# EasyEDA Pro project JLC_Integrating_Sphere_Light_Source_2026-11-10.epro

# Schematic LED_CC_diver_G
Assembly Variant: Basic; Board Name: LED_CC_diver_G; Create Date: 2026-11-09; Page Name: P1; Project Name: LED_CC_diver_G; Schematic Name: LED_CC_diver_G; Update Date: 2026-11-09; Company: 嘉立创EDA; Page Size: A4; Version: V1.0
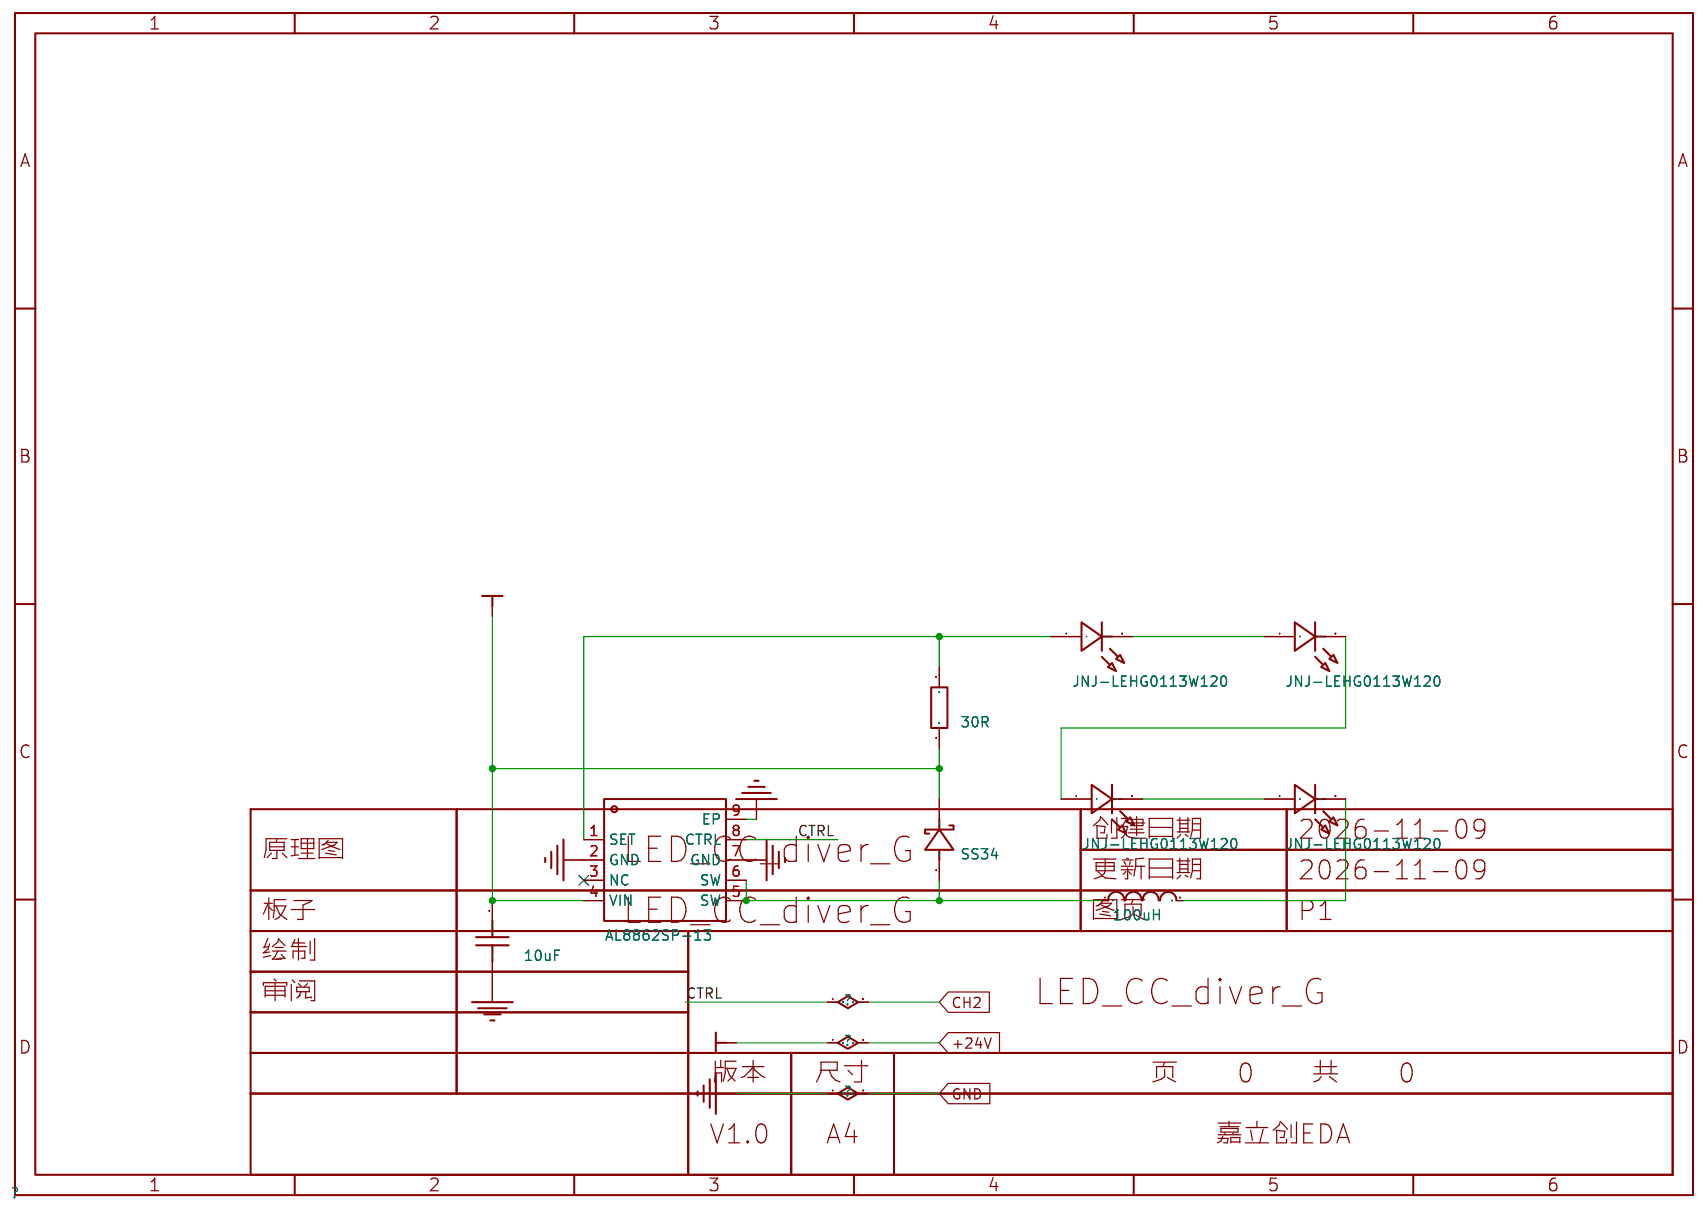
[diagram p0: schematic sheet]

## Parts
C2  10uF  [C1206]
D11  SS34  [SMA_L4.3-W2.6-LS5.0-FD]
L2  100uH  [L1210]
LED_G1  JNJ-LEHG0113W120  [LED-SMD_3P-L3.5-W3.5-R-RD_C9900043159]
LED_G2  JNJ-LEHG0113W120  [LED-SMD_3P-L3.5-W3.5-R-RD_C9900043159]
LED_G3  JNJ-LEHG0113W120  [LED-SMD_3P-L3.5-W3.5-R-RD_C9900043159]
LED_G4  JNJ-LEHG0113W120  [LED-SMD_3P-L3.5-W3.5-R-RD_C9900043159]
R2  30R  [R1206]
U5  AL8862SP-13  [SO-8_L4.9-W3.9-P1.27-LS6.0-BL-EP]

## Library data of the parts
C2 = CAP_1206: Supplier Footprint: 1206
D11 = SS34_C7420365: 二极管配置:独立式;正向压降(Vf):550mV@3A;直流反向耐压(Vr):40V;整流电流:3A;; LCSC Part Name: 电压:40V 电流:3A; Supplier Part: C7420365; Manufacturer: R+O(宏嘉诚); Supplier Footprint: SMA(DO-214AC); JLCPCB Part Class: Extended Part; Datasheet: https://item.szlcsc.com/datasheet/SS34/8397187.html; Supplier: LCSC; Diode Configuration: 独立式; Voltage - Forward(Vf@If): 550mV@3A; Voltage - DC Reverse(Vr): 40V; Current - Rectified: 3A; Reverse Leakage Current (Ir): 200uA@40V; Operating Junction Temperature Range: -55℃~+150℃; Non-Repetitive Peak Forward Surge Current: 80A
L2 = NLV32T-101J-PF: 电感值:100uH;精度:±5%;额定电流:40mA;饱和电流(Isat):-;类型:磁胶屏蔽电感;; LCSC Part Name: 100uH ±5% 停产; Supplier Part: C76836; Manufacturer: TDK; Supplier Footprint: 1210; JLCPCB Part Class: Extended Part; Datasheet: https://item.szlcsc.com/datasheet/NLV32T-101J-PF/77963.html; Supplier: LCSC; Tolerance: ±5%; Current Rating: 40mA; DC Resistance(DCR): 10Ω; Type: 磁胶屏蔽电感
LED_G1-LED_G4 = JNJ-LEHG0113W120/45mil/525-530nm: 灯头类型:3.5mmx3.5mm方形灯头;发光颜色:绿色;正向压降(Vf):2.8V~3.5V;功率:-;正向电流:700mA;波长:515nm~530nm;二极管配置:独立二极管;透镜颜色:无色透明透镜;色温:-;发光强度:50cd;发光角度:120°;载带方式:-;工作温度:-40℃~+100℃;; LCSC Part Name: 3535EMC绿光45mil球头120度灯源525-530nm; Supplier Part: C19185875; Manufacturer: JNJOPTO(强生光电); Supplier Footprint: SMD3535-3P; JLCPCB Part Class: Extended Part; Datasheet: https://item.szlcsc.com/datasheet/JNJ-LEHG0113W120%252F45mil%252F525-530nm/20403680.html; Supplier: LCSC; Lamp Holder Type: 3.5mmx3.5mm方形灯头; Illumination Color: 绿色; Voltage - Forward(Vf): 2.8V~3.5V; Forward Current: 700mA; Wavelength - Dominant: 515nm~530nm; Diode Configuration: 独立二极管; Lens Color: 无色透明透镜; Luminous Intensity: 50cd; Viewing Angle: 120°; Operating Temperature: -40℃~+100℃
R2 = Res_1206: Supplier Footprint: 1206
U5 = AL8862SP-13: 类型:DC-DC;工作电压(DC):5V~60V;开关频率:1MHz;通道数:1;输出电压:-;输出电流:1A;调光:模拟；PWM;拓扑结构:降压;; LCSC Part Name: 60V、1A降压型LED驱动器; Supplier Part: C526360; Manufacturer: DIODES(美台); Supplier Footprint: SO-8-EP; JLCPCB Part Class: Extended Part; Datasheet: https://item.szlcsc.com/datasheet/AL8862SP-13/544575.html; Supplier: LCSC; Type: DC-DC; Voltage - Input(DC): 5V~60V; Frequency - Switching: 1MHz; Number of Channels: 1; Output Current: 1A; Dimming: 模拟；PWM; Features: 内置软启动；LED开路保护；过温保护(OTP)；短路保护(SCP); Topology: 降压; Operating temperature: -40℃~+105℃; Switch Tube (Built-In/External): 内置; Constant Current Accuracy: 4%

## Nets
+24V: C2.1 D11.2(K) R2.1 U5.4(VIN)
GND: C2.2 U5.2(GND) U5.7(GND) U5.9(EP)
CH2: U5.8(CTRL)
Net-(D11-1): D11.1(A) L2.1 U5.5(SW) U5.6(SW)
Net-(L2-2): L2.2 LED_G1.3(K)
Net-(LED_G1-1): LED_G1.1(A) LED_G3.3(K)
Net-(LED_G2-1): LED_G2.1(A) R2.2 U5.1(SET)
Net-(LED_G2-3): LED_G2.3(K) LED_G4.1(A)
Net-(LED_G3-1): LED_G3.1(A) LED_G4.3(K)

Not connected (* = marked no-connect by the designer): U5 3(NC)*

# Schematic PWR
Assembly Variant: Basic; Board Name: PWR; Create Date: 2026-11-09; Page Name: P1; Project Name: PWR; Schematic Name: PWR; Update Date: 2026-11-09; Company: 嘉立创EDA; Page Size: A4; Version: V1.0
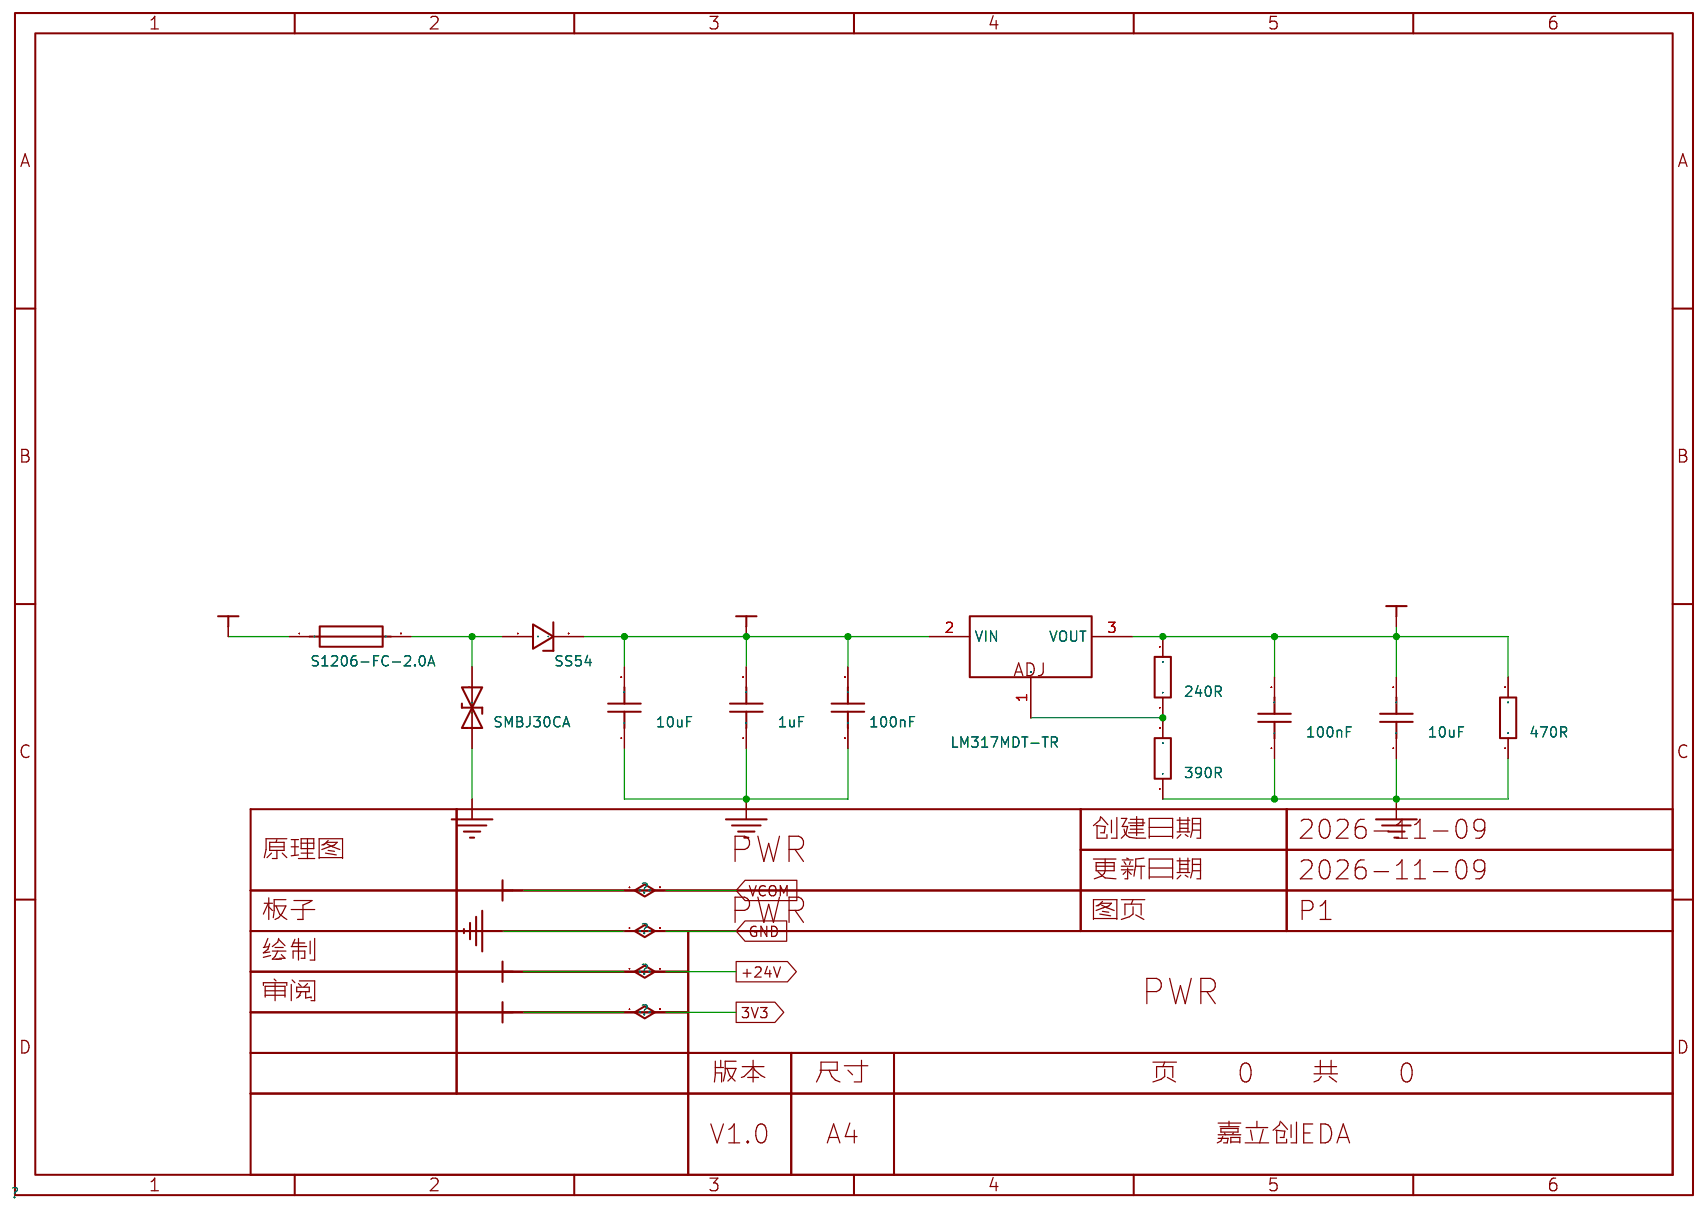
[diagram p1: schematic sheet]

## Parts
C7  10uF  [C0805]
C8  100nF  [C0603]
C9  1uF  [C0805]
C10  10uF  [C0805]
C11  100nF  [C0603]
D22  SMBJ30CA  [SMB_L4.3-W3.6-LS5.4-BI]
D24  SS54  [SMA_L4.3-W2.6-LS5.0-FD]
F2  S1206-FC-2.0A  [F1206]
R6  240R  [R0603]
R7  390R  [R0603]
R8  470R  [R0603]
U1  LM317MDT-TR  [TO-252-2_L6.6-W6.1-P4.57-LS9.9-TL]

## Library data of the parts
C7 C9 C10 = CAP_0805: Supplier Footprint: 0805
C8 C11 = CAP_0603: Supplier Footprint: 0603
D22 = SMBJ30CA_C83847: 极性:双向;反向截止电压(Vrwm):30V;钳位电压:48.4V;峰值脉冲电流(Ipp):12.4A;峰值脉冲功率(Ppp):600W@10/1000us;击穿电压(VBR):33.3V;; LCSC Part Name: 双向TVS 30V截止 峰值浪涌电流：12.4A; Supplier Part: C83847; Manufacturer: Littelfuse(美国力特); Supplier Footprint: DO-214AA; JLCPCB Part Class: Extended Part; Datasheet: https://item.szlcsc.com/datasheet/SMBJ30CA/85014.html; Supplier: LCSC; Polarity: 双向; Reverse Stand-Off Voltage (Vrwm): 30V; Clamping Voltage: 48.4V; Peak Pulse Current (Ipp): 12.4A; Peak Pulse Power Dissipation (Ppp): 600W@10/1000us; Voltage - Breakdown: 33.3V; Reverse Leakage Current (Ir): 1uA; Number of Channels: 单路; Operating Temperature: -65℃~+150℃; level of protection: IEC 61000-4-4；IEC 61000-4-2; Type: TVS
D24 = SS54_C7420369: 二极管配置:1个独立式;正向压降(Vf):550mV@5A;直流反向耐压(Vr):40V;整流电流:5A;; LCSC Part Name: 电压:40V 电流:5A; Supplier Part: C7420369; Manufacturer: R+O(宏嘉诚); Supplier Footprint: SMA(DO-214AC); JLCPCB Part Class: Extended Part; Datasheet: https://item.szlcsc.com/datasheet/SS54/8397191.html; Supplier: LCSC; Diode Configuration: 1个独立式; Voltage - Forward(Vf@If): 550mV@5A; Voltage - DC Reverse(Vr): 40V; Current - Rectified: 5A; Reverse Leakage Current (Ir): 200uA@40V; Operating Junction Temperature Range: -55℃~+125℃; Non-Repetitive Peak Forward Surge Current: 120A
F2 = S1206-FC-2.0A: 类型:贴片式保险丝;额定电流:2A;额定电压:100V;分断能力:50A@100VDC;; LCSC Part Name: 保险丝 2A 100V; Supplier Part: C2691995; Manufacturer: SART(萨特); Supplier Footprint: 1206; JLCPCB Part Class: Extended Part; Datasheet: https://item.szlcsc.com/datasheet/S1206-FC-2.0A/2802628.html; Supplier: LCSC; Type: 贴片式保险丝; Current Rating: 2A; Voltage Rating (DC): 100V; Operating Temperature: -55℃~+125℃; Melting I2t: 0.1; Interrupt Rating: 50A@100VDC; Length: 3.2mm; Width: 1.6mm; Height: 0.8mm
R6-R8 = Res_0603: Supplier Footprint: 0603
U1 = LM317MDT-TR: 输出极性:正极;工作电压:40V;输出电压:1.2V~37V;输出电流:500mA;电源纹波抑制比(PSRR):80dB@(120Hz);输出类型:可调;; LCSC Part Name: 1.2V~37V 500mA 40V; Supplier Part: C68136; Manufacturer: ST(意法半导体); Supplier Footprint: TO-252-2(DPAK); JLCPCB Part Class: Extended Part; Datasheet: https://item.szlcsc.com/datasheet/LM317MDT-TR/69238.html; Supplier: LCSC; Output Configuration: 正极; Voltage - Supply: 40V; Output Voltage: 1.2V~37V; Output Current: 500mA; Power Supply Rejection Ratio (PSRR): 80dB@(120Hz); Noise: 0.003%Vout; Features: 短路保护；热关断; Operating Temperature: 0℃~+125℃@(Tj); Output Type: 可调; Number of Outputs: 1

## Nets
3V3: C10.2 C11.2 R6.2 R8.2 U1.3(VOUT)
+24V: C7.2 C8.2 C9.2 D24.2(K) U1.2(VIN)
GND: C7.1 C8.1 C9.1 C10.1 C11.1 D22.2(A1) R7.1 R8.1
VCOM: F2.1
Net-(D22-1): D22.1(A2) D24.1(A) F2.2
Net-(R6-1): R6.1 R7.2 U1.1(ADJ)

# Schematic DAC_driver
Assembly Variant: Basic; Board Name: DAC_driver; Create Date: 2026-11-09; Page Name: P1; Project Name: DAC_driver; Schematic Name: DAC_driver; Update Date: 2026-11-09; Company: 嘉立创EDA; Page Size: A4; Version: V1.0
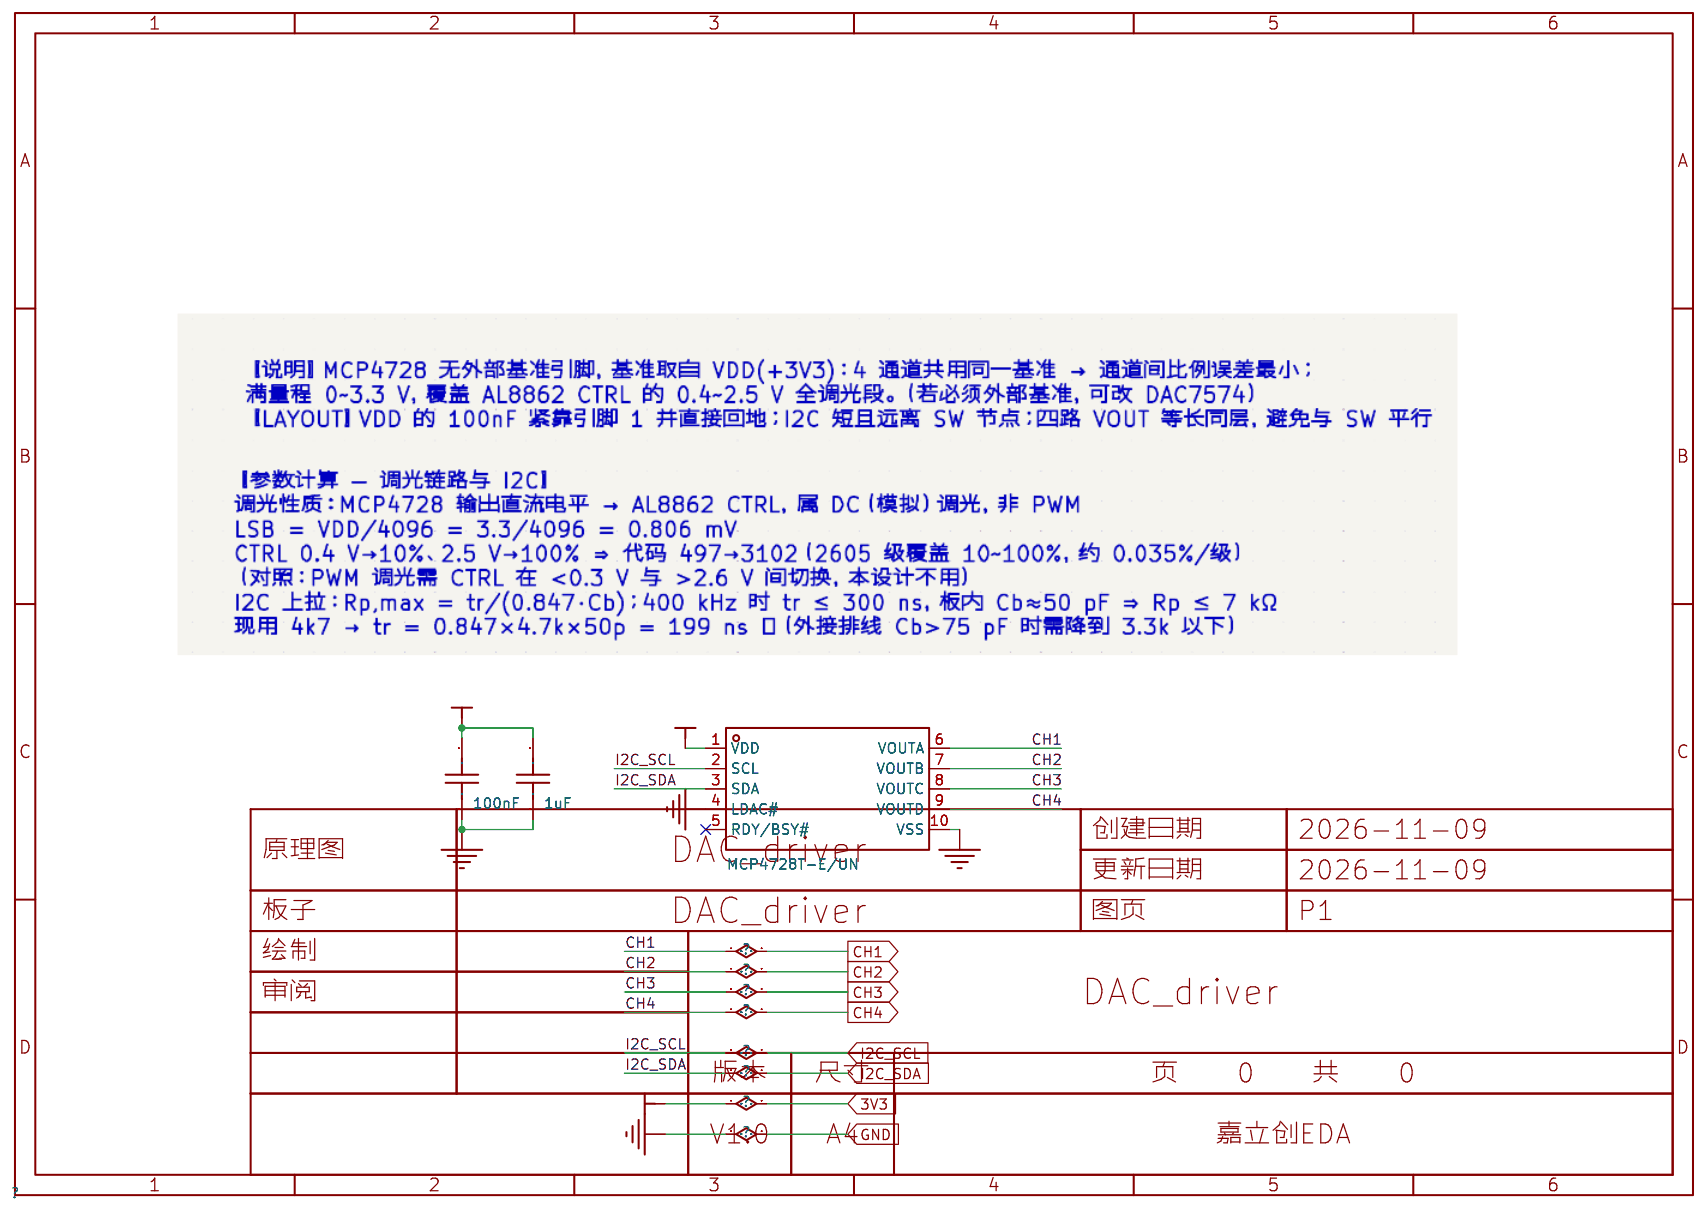
[diagram p2: schematic sheet]

## Parts
C12  100nF  [C0603]
C13  1uF  [C0603]
U3  MCP4728T-E/UN  [MSOP-10_L3.0-W3.0-P0.50-LS4.9-BL]

## Library data of the parts
C12 C13 = CAP_0603: Supplier Footprint: 0603
U3 = MCP4728T-E/UN: 分辨率(位):12位;接口类型:I2C;工作电压:2.7V~5.5V;建立时间:6us;积分非线性:2LSB;; LCSC Part Name: 12位四通道带EEPROM的数模转换器; Supplier Part: C478093; Manufacturer: MICROCHIP(美国微芯); Supplier Footprint: MSOP-10; JLCPCB Part Class: Extended Part; Datasheet: https://item.szlcsc.com/datasheet/MCP4728T-E%252FUN/485402.html; Supplier: LCSC; Resolution (Bits): 12位; Number of Channels: 4; Interface: I2C; Voltage - Supply: 2.7V~5.5V; Settling Time: 6us; Output Type: 电压-缓冲; Integral non - linearity: 2LSB; Operating Temperature: -40℃~+125℃; Function: 可编程增益；集成缓冲器；掉电模式；上电复位; Quiescent Current (Iq): 40nA

## Nets
3V3: C12.2 C13.2 U3.1(VDD)
GND: C12.1 C13.1 U3.4(LDAC#) U3.10(VSS)
CH1: U3.6(VOUTA)
CH2: U3.7(VOUTB)
CH3: U3.8(VOUTC)
CH4: U3.9(VOUTD)
I2C_SCL: U3.2(SCL)
I2C_SDA: U3.3(SDA)

Not connected (* = marked no-connect by the designer): U3 5(RDY/BSY#)*

# Schematic Light_Sensor
Assembly Variant: Basic; Board Name: Light_Sensor; Create Date: 2026-11-09; Page Name: P1; Project Name: Light_Sensor; Schematic Name: Light_Sensor; Update Date: 2026-11-09; Company: 嘉立创EDA; Page Size: A4; Version: V1.0
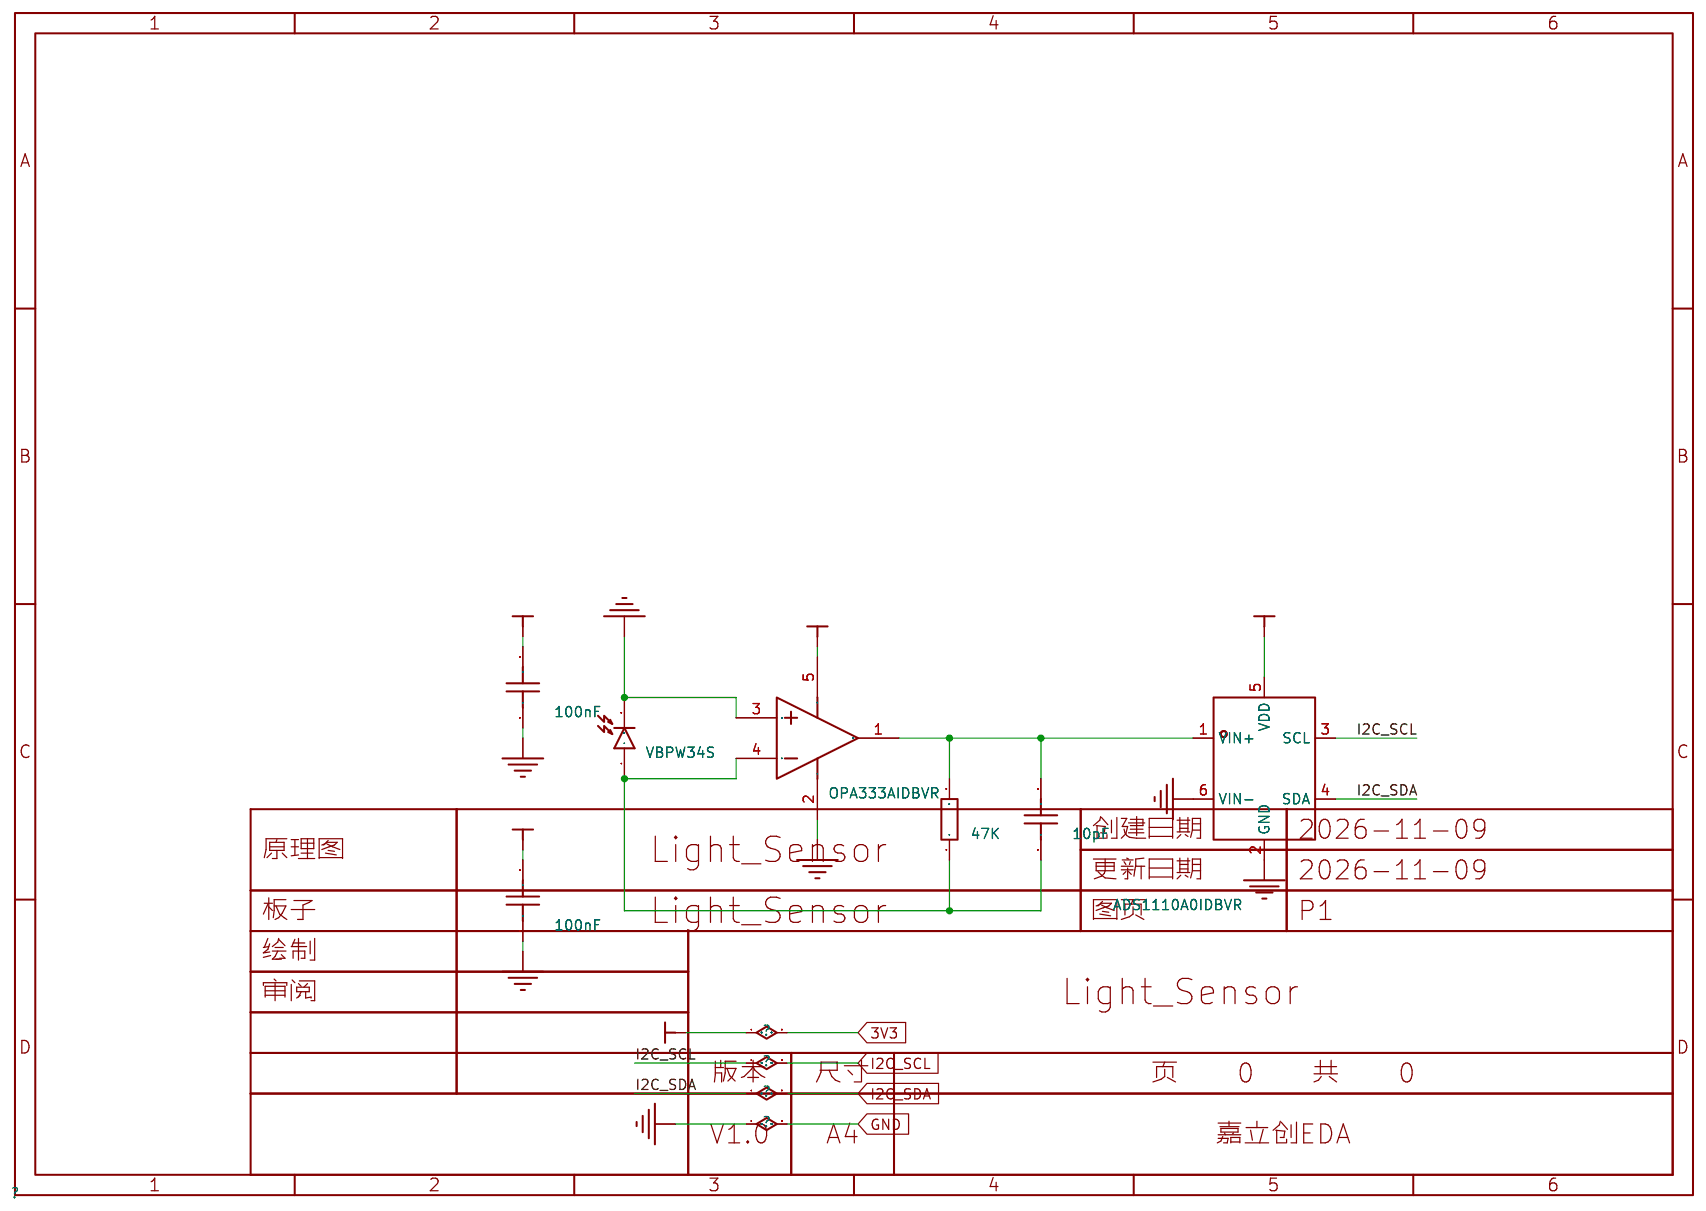
[diagram p3: schematic sheet]

## Parts
C14  10pF  [C0603]
C15  100nF  [C0603]
C16  100nF  [C0603]
D1  VBPW34S  [SENSOR-SMD_L4.4-W3.9]
R11  47K  [R0603]
U1  ADS1110A0IDBVR  [SOT-23-6_L2.9-W1.6-P0.95-LS2.8-BR]
U2  OPA333AIDBVR  [SOT-23-5_L3.0-W1.7-P0.95-LS2.8-BR]

## Library data of the parts
C14-C16 = CAP_0603: Supplier Footprint: 0603
D1 = VBPW34S: 直流反向耐压(Vr):60V;接收角度:65°;峰值波长:940nm;频谱范围:430nm~1100nm;暗电流:2nA;; LCSC Part Name: 940nm 频谱范围430nm~1100nm 反向电压60V; Supplier Part: C145262; Manufacturer: VISHAY(威世); Supplier Footprint: SMD,4.4x3.9mm; JLCPCB Part Class: Extended Part; Datasheet: https://item.szlcsc.com/datasheet/VBPW34S/156594.html; Supplier: LCSC; Voltage - DC Reverse(Vr): 60V; Viewing Angle: 65°; Peak Wavelength: 940nm; Spectral Range: 430nm~1100nm; Dark Current: 2nA; Operating Temperature: -40℃~+100℃; Pd - Power Dissipation: 215mW
R11 = Res_0603: Supplier Footprint: 0603
U1 = ADS1110A0IDBVR: 分辨率(位):16;采样率:15Hz;工作电压:2.7V~5.5V;接口类型:I2C;; LCSC Part Name: 16位模拟到数字转换器 带板载参考源; Supplier Part: C16598; Manufacturer: TI(德州仪器); Supplier Footprint: SOT-23-6; JLCPCB Part Class: Extended Part; Datasheet: https://www.ti.com/cn/lit/ds/symlink/ads1110.pdf; Supplier: LCSC; Resolution (Bits): 16; Sampling Rate: 15Hz; number of channels: 1; Voltage - Supply: 2.7V~5.5V; Interface: I2C; differential input: 是; Operating Temperature: -40℃~+85℃; Clock/Oscillator: 内置; Clock Frequency: 275kHz; Voltage Reference: 内置; Programmable Gain: 支持; ADC architecture: Sigma-Delta; Quiescent Current (Iq): 50nA；2uA; Features: 软复位；上电复位；自动校准
U2 = OPA333AIDBVR: 放大器数:单路;输入失调电压(Vos):2uV;增益带宽积(GBW):350kHz;轨到轨:轨到轨输入,轨到轨输出;压摆率(SR):0.16V/us;输入偏置电流(Ib):70pA;; LCSC Part Name: OPAx333 1.8V微功耗CMOS运算放大器零漂移系列; Supplier Part: C30878; Manufacturer: TI(德州仪器); Supplier Footprint: SOT-23-5; JLCPCB Part Class: Extended Part; Datasheet: https://www.ti.com/cn/lit/ds/symlink/opa333.pdf; Supplier: LCSC; Number of Channels: 单路; Single Supply: 1.8V~5.5V; Dual Supply: 900mV~2.75V；-2.75V~-900mV; Vos - Input Offset Voltage: 2uV; Input Offset Voltage Drift(Vos TC): 50nV/℃; Gain Bandwidth Product: 350kHz; Rail to Rail: 轨到轨输入,轨到轨输出; Slew Rate: 0.16V/us; Common Mode Rejection Ratio(CMRR): 130dB; Ib - Input Bias Current: 70pA; Quiescent Current(Iq): 17uA; Output Current: 5mA; Input Offset Current(Ios): 400pA; Operating Temperature: -40℃~+125℃; Features: 零漂移/自动稳零

## Nets
3V3: C15.2 C16.2 U1.5(VDD) U2.5(V+)
GND: C15.1 C16.1 D1.2(C) U1.2(GND) U1.6(VIN-) U2.2(V-) U2.3(IN+)
I2C_SCL: U1.3(SCL)
I2C_SDA: U1.4(SDA)
Net-(C14-1): C14.1 D1.1(A) R11.1 U2.4(IN-)
Net-(C14-2): C14.2 R11.2 U1.1(VIN+) U2.1(OUT)

# Schematic LED_CC_driver_IR
Assembly Variant: Basic; Board Name: LED_CC_driver_IR; Create Date: 2026-11-09; Page Name: P1; Project Name: LED_CC_driver_IR; Schematic Name: LED_CC_driver_IR; Update Date: 2026-11-09; Company: 嘉立创EDA; Page Size: A4; Version: V1.0
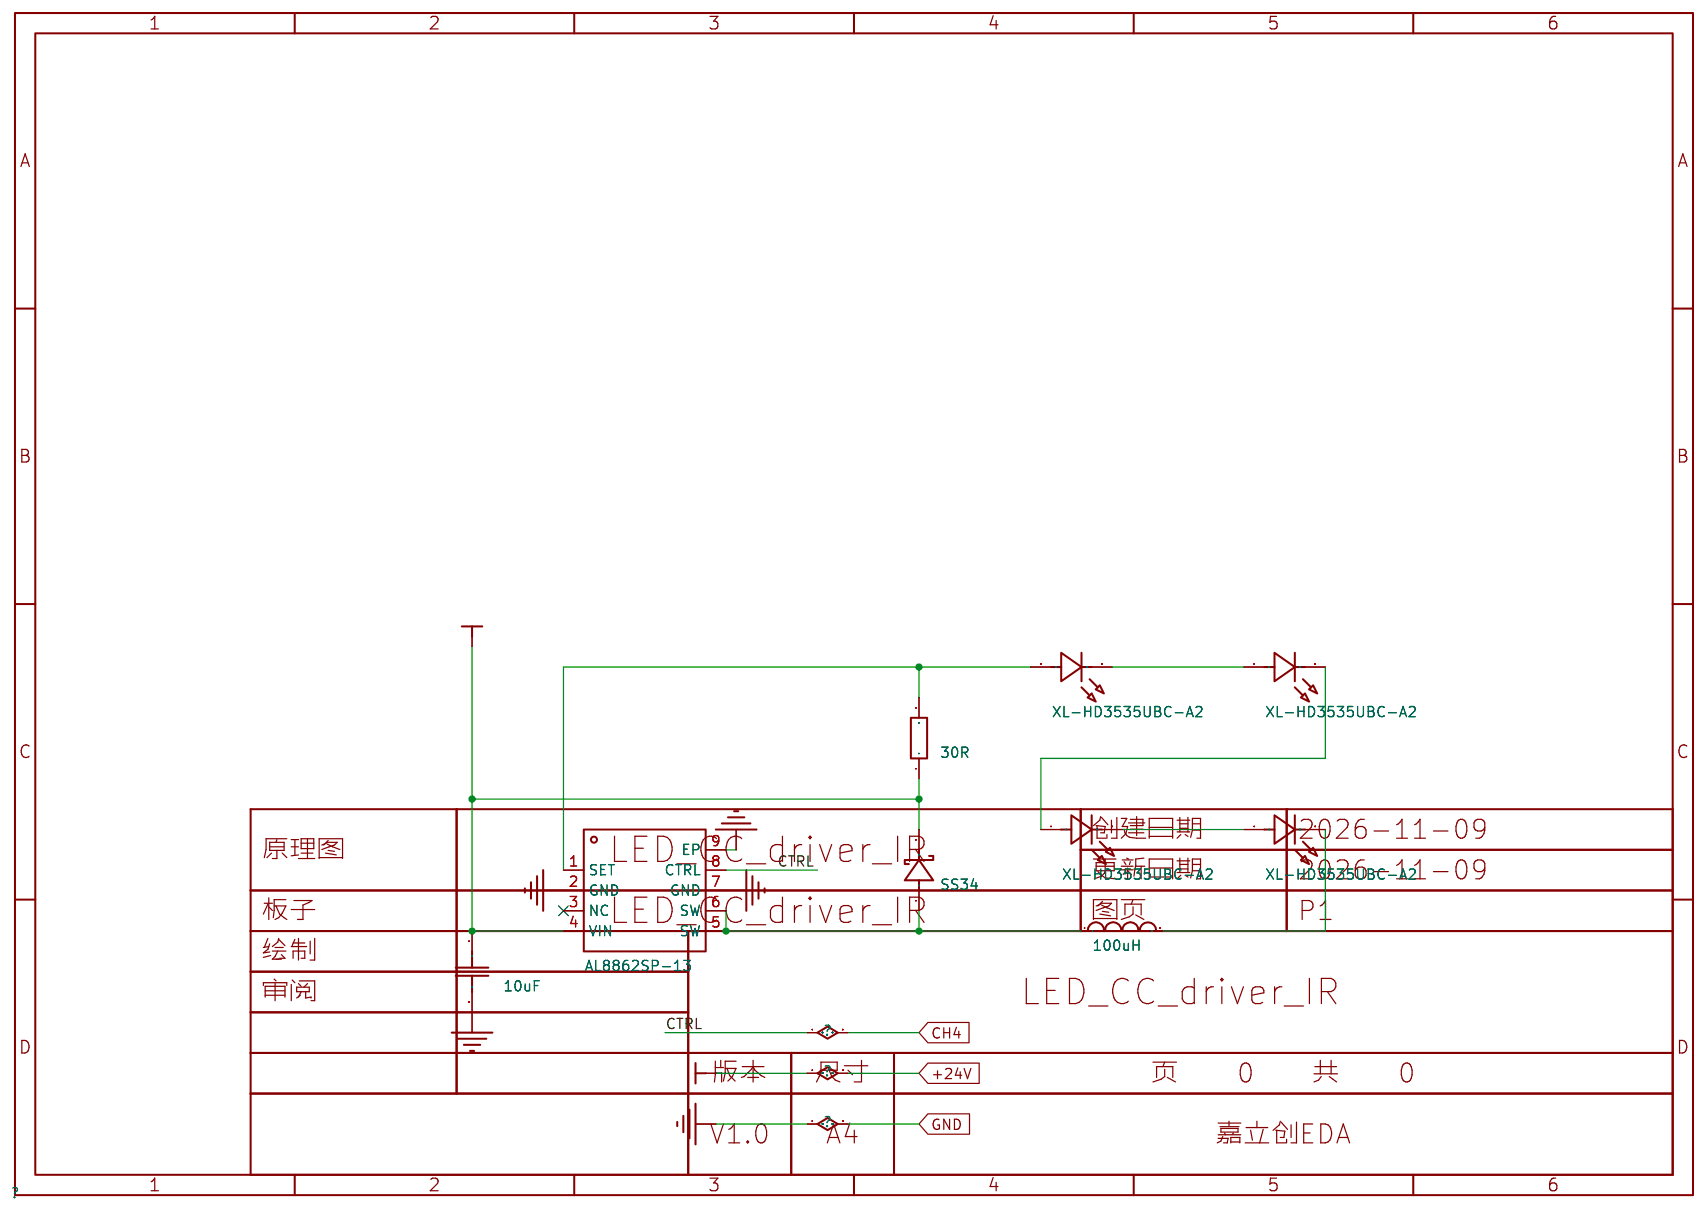
[diagram p4: schematic sheet]

## Parts
C4  10uF  [C1206]
D21  SS34  [SMA_L4.3-W2.6-LS5.0-FD]
L3  100uH  [L1210]
LED_B1  XL-HD3535UBC-A2  [LED-SMD_3P-L3.5-W3.5_XL-HD3535UBC-A2-1]
LED_B2  XL-HD3535UBC-A2  [LED-SMD_3P-L3.5-W3.5_XL-HD3535UBC-A2-1]
LED_B3  XL-HD3535UBC-A2  [LED-SMD_3P-L3.5-W3.5_XL-HD3535UBC-A2-1]
LED_B4  XL-HD3535UBC-A2  [LED-SMD_3P-L3.5-W3.5_XL-HD3535UBC-A2-1]
R4  30R  [R1206]
U7  AL8862SP-13  [SO-8_L4.9-W3.9-P1.27-LS6.0-BL-EP]

## Library data of the parts
C4 = CAP_1206: Supplier Footprint: 1206
D21 = SS34_C7420365: 二极管配置:独立式;正向压降(Vf):550mV@3A;直流反向耐压(Vr):40V;整流电流:3A;; LCSC Part Name: 电压:40V 电流:3A; Supplier Part: C7420365; Manufacturer: R+O(宏嘉诚); Supplier Footprint: SMA(DO-214AC); JLCPCB Part Class: Extended Part; Datasheet: https://item.szlcsc.com/datasheet/SS34/8397187.html; Supplier: LCSC; Diode Configuration: 独立式; Voltage - Forward(Vf@If): 550mV@3A; Voltage - DC Reverse(Vr): 40V; Current - Rectified: 3A; Reverse Leakage Current (Ir): 200uA@40V; Operating Junction Temperature Range: -55℃~+150℃; Non-Repetitive Peak Forward Surge Current: 80A
L3 = NLV32T-101J-PF: 电感值:100uH;精度:±5%;额定电流:40mA;饱和电流(Isat):-;类型:磁胶屏蔽电感;; LCSC Part Name: 100uH ±5% 停产; Supplier Part: C76836; Manufacturer: TDK; Supplier Footprint: 1210; JLCPCB Part Class: Extended Part; Datasheet: https://item.szlcsc.com/datasheet/NLV32T-101J-PF/77963.html; Supplier: LCSC; Tolerance: ±5%; Current Rating: 40mA; DC Resistance(DCR): 10Ω; Type: 磁胶屏蔽电感
LED_B1-LED_B4 = XL-HD3535UBC-A2: 灯头类型:3.5mmx3.5mm方形灯头;发光颜色:蓝色;正向压降(Vf):3.4V;功率:1W;测试电流:350mA;波长:455nm~470nm;二极管配置:独立二极管;透镜颜色:无色透明透镜;色温:-;发光强度:-;发光角度:130°;载带方式:正贴;工作温度:-40℃~+135℃;; LCSC Part Name: 3535球头蓝1W贴片式发光二极管; Supplier Part: C3646953; Manufacturer: XINGLIGHT(成兴光); Supplier Footprint: SMD3535-3P; JLCPCB Part Class: Extended Part; Datasheet: https://item.szlcsc.com/datasheet/XL-HD3535UBC-A2/4213796.html; Supplier: LCSC; Lamp Holder Type: 3.5mmx3.5mm方形灯头; Illumination Color: 蓝色; Voltage - Forward(Vf): 3.4V; Power(Watts): 1W; Test Current: 350mA; Wavelength - Dominant: 455nm~470nm; Peak Wavelength: 465nm; Diode Configuration: 独立二极管; Lens Color: 无色透明透镜; Viewing Angle: 130°; Mounting Style: 正贴; Operating Temperature: -40℃~+135℃
R4 = Res_1206: Supplier Footprint: 1206
U7 = AL8862SP-13: 类型:DC-DC;工作电压(DC):5V~60V;开关频率:1MHz;通道数:1;输出电压:-;输出电流:1A;调光:模拟；PWM;拓扑结构:降压;; LCSC Part Name: 60V、1A降压型LED驱动器; Supplier Part: C526360; Manufacturer: DIODES(美台); Supplier Footprint: SO-8-EP; JLCPCB Part Class: Extended Part; Datasheet: https://item.szlcsc.com/datasheet/AL8862SP-13/544575.html; Supplier: LCSC; Type: DC-DC; Voltage - Input(DC): 5V~60V; Frequency - Switching: 1MHz; Number of Channels: 1; Output Current: 1A; Dimming: 模拟；PWM; Features: 内置软启动；LED开路保护；过温保护(OTP)；短路保护(SCP); Topology: 降压; Operating temperature: -40℃~+105℃; Switch Tube (Built-In/External): 内置; Constant Current Accuracy: 4%

## Nets
+24V: C4.1 D21.2(K) R4.1 U7.4(VIN)
GND: C4.2 U7.2(GND) U7.7(GND) U7.9(EP)
CH4: U7.8(CTRL)
Net-(D21-1): D21.1(A) L3.1 U7.5(SW) U7.6(SW)
Net-(L3-2): L3.2 LED_B1.2(C)
Net-(LED_B1-1): LED_B1.1(A) LED_B3.2(C)
Net-(LED_B2-1): LED_B2.1(A) R4.2 U7.1(SET)
Net-(LED_B2-2): LED_B2.2(C) LED_B4.1(A)
Net-(LED_B3-1): LED_B3.1(A) LED_B4.2(C)

Not connected (* = marked no-connect by the designer): U7 3(NC)*

# Schematic LED_CC_driver_R
Assembly Variant: Basic; Board Name: LED_CC_driver_R; Create Date: 2026-11-09; Page Name: P1; Project Name: LED_CC_driver_R; Schematic Name: LED_CC_driver_R; Update Date: 2026-11-09; Company: 嘉立创EDA; Page Size: A4; Version: V1.0
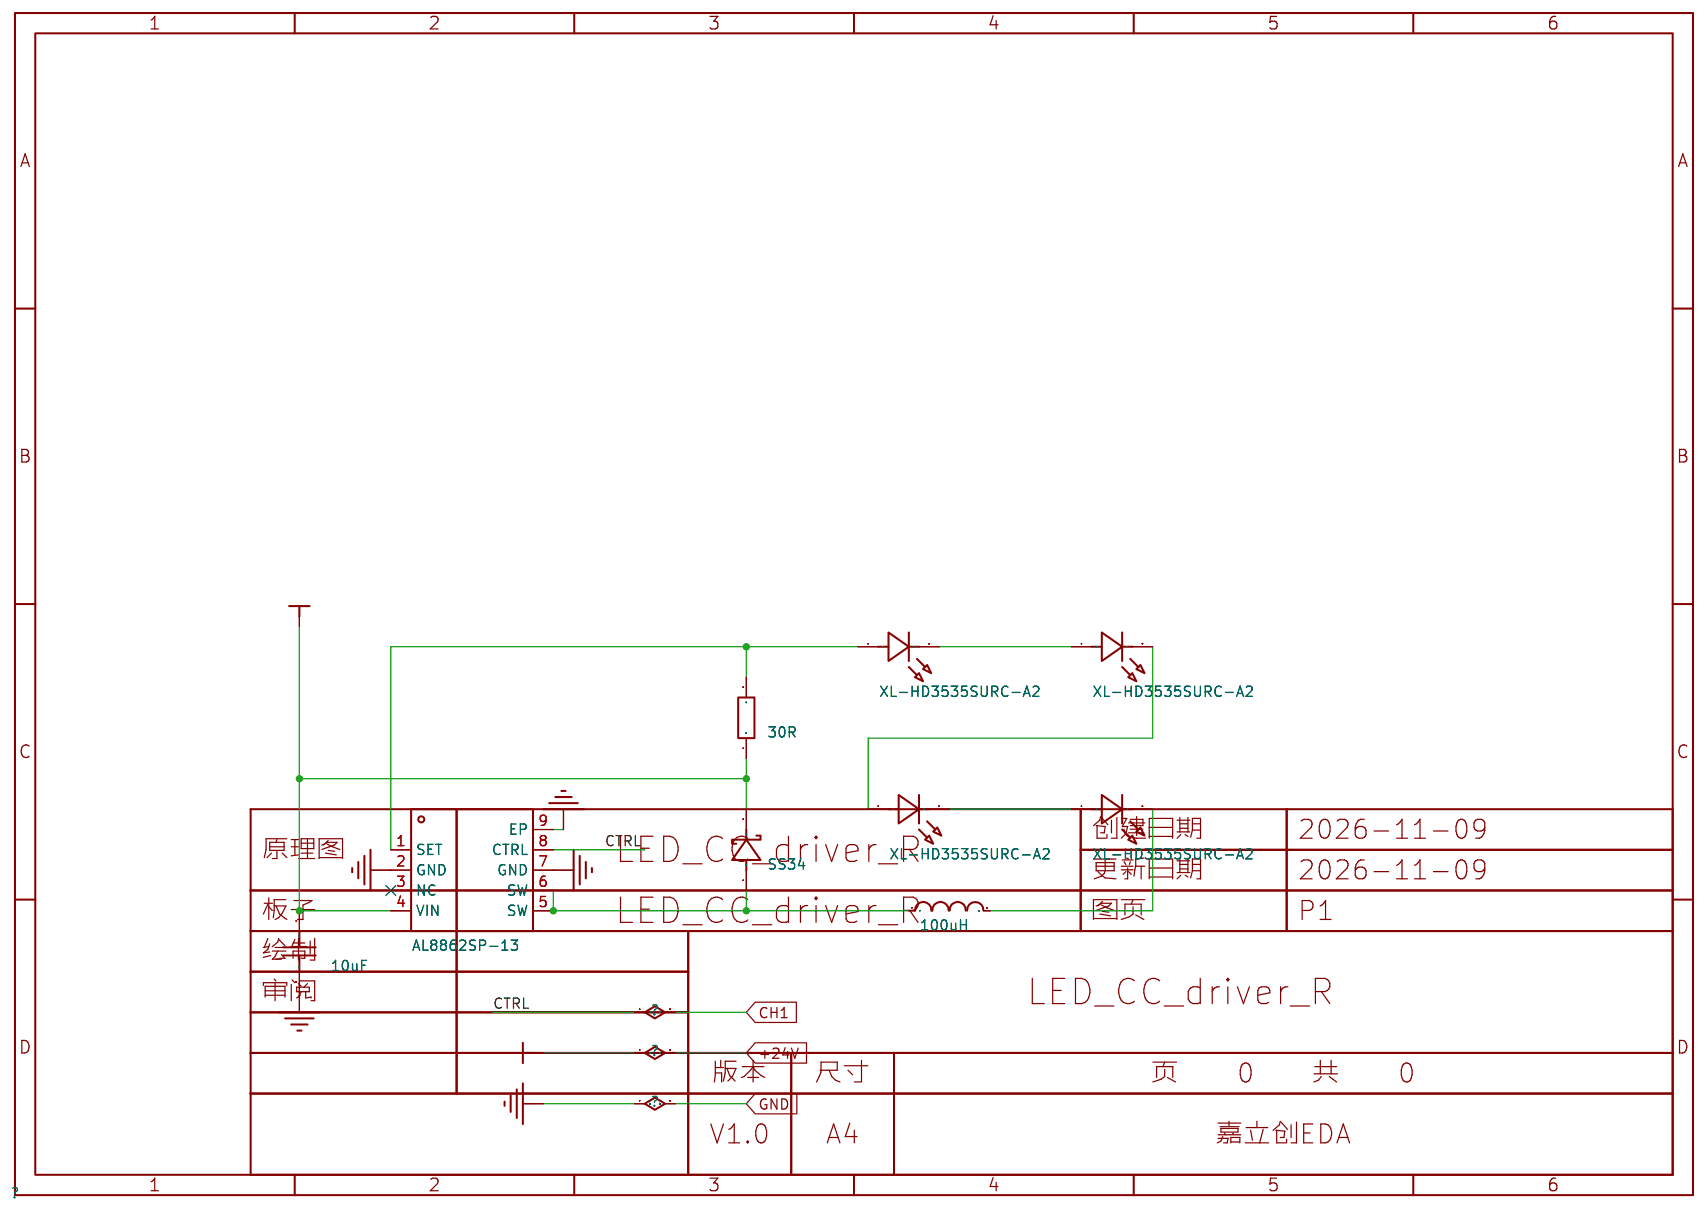
[diagram p5: schematic sheet]

## Parts
C1  10uF  [C1206]
D6  SS34  [SMA_L4.3-W2.6-LS5.0-FD]
L1  100uH  [L1210]
LED_R1  XL-HD3535SURC-A2  [LED-SMD_3P-L3.5-W3.5-R-RD-2]
LED_R2  XL-HD3535SURC-A2  [LED-SMD_3P-L3.5-W3.5-R-RD-2]
LED_R3  XL-HD3535SURC-A2  [LED-SMD_3P-L3.5-W3.5-R-RD-2]
LED_R4  XL-HD3535SURC-A2  [LED-SMD_3P-L3.5-W3.5-R-RD-2]
R1  30R  [R1206]
U4  AL8862SP-13  [SO-8_L4.9-W3.9-P1.27-LS6.0-BL-EP]

## Library data of the parts
C1 = CAP_1206: Supplier Footprint: 1206
D6 = SS34_C7420365: 二极管配置:独立式;正向压降(Vf):550mV@3A;直流反向耐压(Vr):40V;整流电流:3A;; LCSC Part Name: 电压:40V 电流:3A; Supplier Part: C7420365; Manufacturer: R+O(宏嘉诚); Supplier Footprint: SMA(DO-214AC); JLCPCB Part Class: Extended Part; Datasheet: https://item.szlcsc.com/datasheet/SS34/8397187.html; Supplier: LCSC; Diode Configuration: 独立式; Voltage - Forward(Vf@If): 550mV@3A; Voltage - DC Reverse(Vr): 40V; Current - Rectified: 3A; Reverse Leakage Current (Ir): 200uA@40V; Operating Junction Temperature Range: -55℃~+150℃; Non-Repetitive Peak Forward Surge Current: 80A
L1 = NLV32T-101J-PF: 电感值:100uH;精度:±5%;额定电流:40mA;饱和电流(Isat):-;类型:磁胶屏蔽电感;; LCSC Part Name: 100uH ±5% 停产; Supplier Part: C76836; Manufacturer: TDK; Supplier Footprint: 1210; JLCPCB Part Class: Extended Part; Datasheet: https://item.szlcsc.com/datasheet/NLV32T-101J-PF/77963.html; Supplier: LCSC; Tolerance: ±5%; Current Rating: 40mA; DC Resistance(DCR): 10Ω; Type: 磁胶屏蔽电感
LED_R1-LED_R4 = XL-HD3535SURC-A2: 灯头类型:3.5mm方形灯头;发光颜色:红色;正向压降(Vf):2.4V;功率:1W;正向电流:350mA;波长:615nm~630nm;二极管配置:独立二极管;透镜颜色:无色透明透镜;色温:-;发光强度:-;发光角度:130°;载带方式:正贴;工作温度:-40℃~+85℃;; LCSC Part Name: 3535球头红1W贴片式发光二极管; Supplier Part: C3646952; Manufacturer: XINGLIGHT(成兴光); Supplier Footprint: SMD3535-3P; JLCPCB Part Class: Extended Part; Datasheet: https://item.szlcsc.com/datasheet/XL-HD3535SURC-A2/4213795.html; Supplier: LCSC; Lamp Holder Type: 3.5mm方形灯头; Illumination Color: 红色; Voltage - Forward(Vf): 2.4V; Power(Watts): 1W; Forward Current: 350mA; Wavelength - Dominant: 615nm~630nm; Peak Wavelength: 625nm; Diode Configuration: 独立二极管; Lens Color: 无色透明透镜; Viewing Angle: 130°; Mounting Style: 正贴; Operating Temperature: -40℃~+85℃
R1 = Res_1206: Supplier Footprint: 1206
U4 = AL8862SP-13: 类型:DC-DC;工作电压(DC):5V~60V;开关频率:1MHz;通道数:1;输出电压:-;输出电流:1A;调光:模拟；PWM;拓扑结构:降压;; LCSC Part Name: 60V、1A降压型LED驱动器; Supplier Part: C526360; Manufacturer: DIODES(美台); Supplier Footprint: SO-8-EP; JLCPCB Part Class: Extended Part; Datasheet: https://item.szlcsc.com/datasheet/AL8862SP-13/544575.html; Supplier: LCSC; Type: DC-DC; Voltage - Input(DC): 5V~60V; Frequency - Switching: 1MHz; Number of Channels: 1; Output Current: 1A; Dimming: 模拟；PWM; Features: 内置软启动；LED开路保护；过温保护(OTP)；短路保护(SCP); Topology: 降压; Operating temperature: -40℃~+105℃; Switch Tube (Built-In/External): 内置; Constant Current Accuracy: 4%

## Nets
+24V: C1.1 D6.2(K) R1.1 U4.4(VIN)
GND: C1.2 U4.2(GND) U4.7(GND) U4.9(EP)
CH1: U4.8(CTRL)
Net-(D6-1): D6.1(A) L1.1 U4.5(SW) U4.6(SW)
Net-(L1-2): L1.2 LED_R1.2(K)
Net-(LED_R1-1): LED_R1.1(A) LED_R3.2(K)
Net-(LED_R2-1): LED_R2.1(A) R1.2 U4.1(SET)
Net-(LED_R2-2): LED_R2.2(K) LED_R4.1(A)
Net-(LED_R3-1): LED_R3.1(A) LED_R4.2(K)

Not connected (* = marked no-connect by the designer): U4 3(NC)*

# Schematic LED_CC_driver_B
Assembly Variant: Basic; Board Name: LED_CC_driver_B; Create Date: 2026-11-09; Page Name: P1; Project Name: LED_CC_diver_B; Schematic Name: LED_CC_driver_B; Update Date: 2026-11-09; Company: 嘉立创EDA; Page Size: A4; Version: V1.0
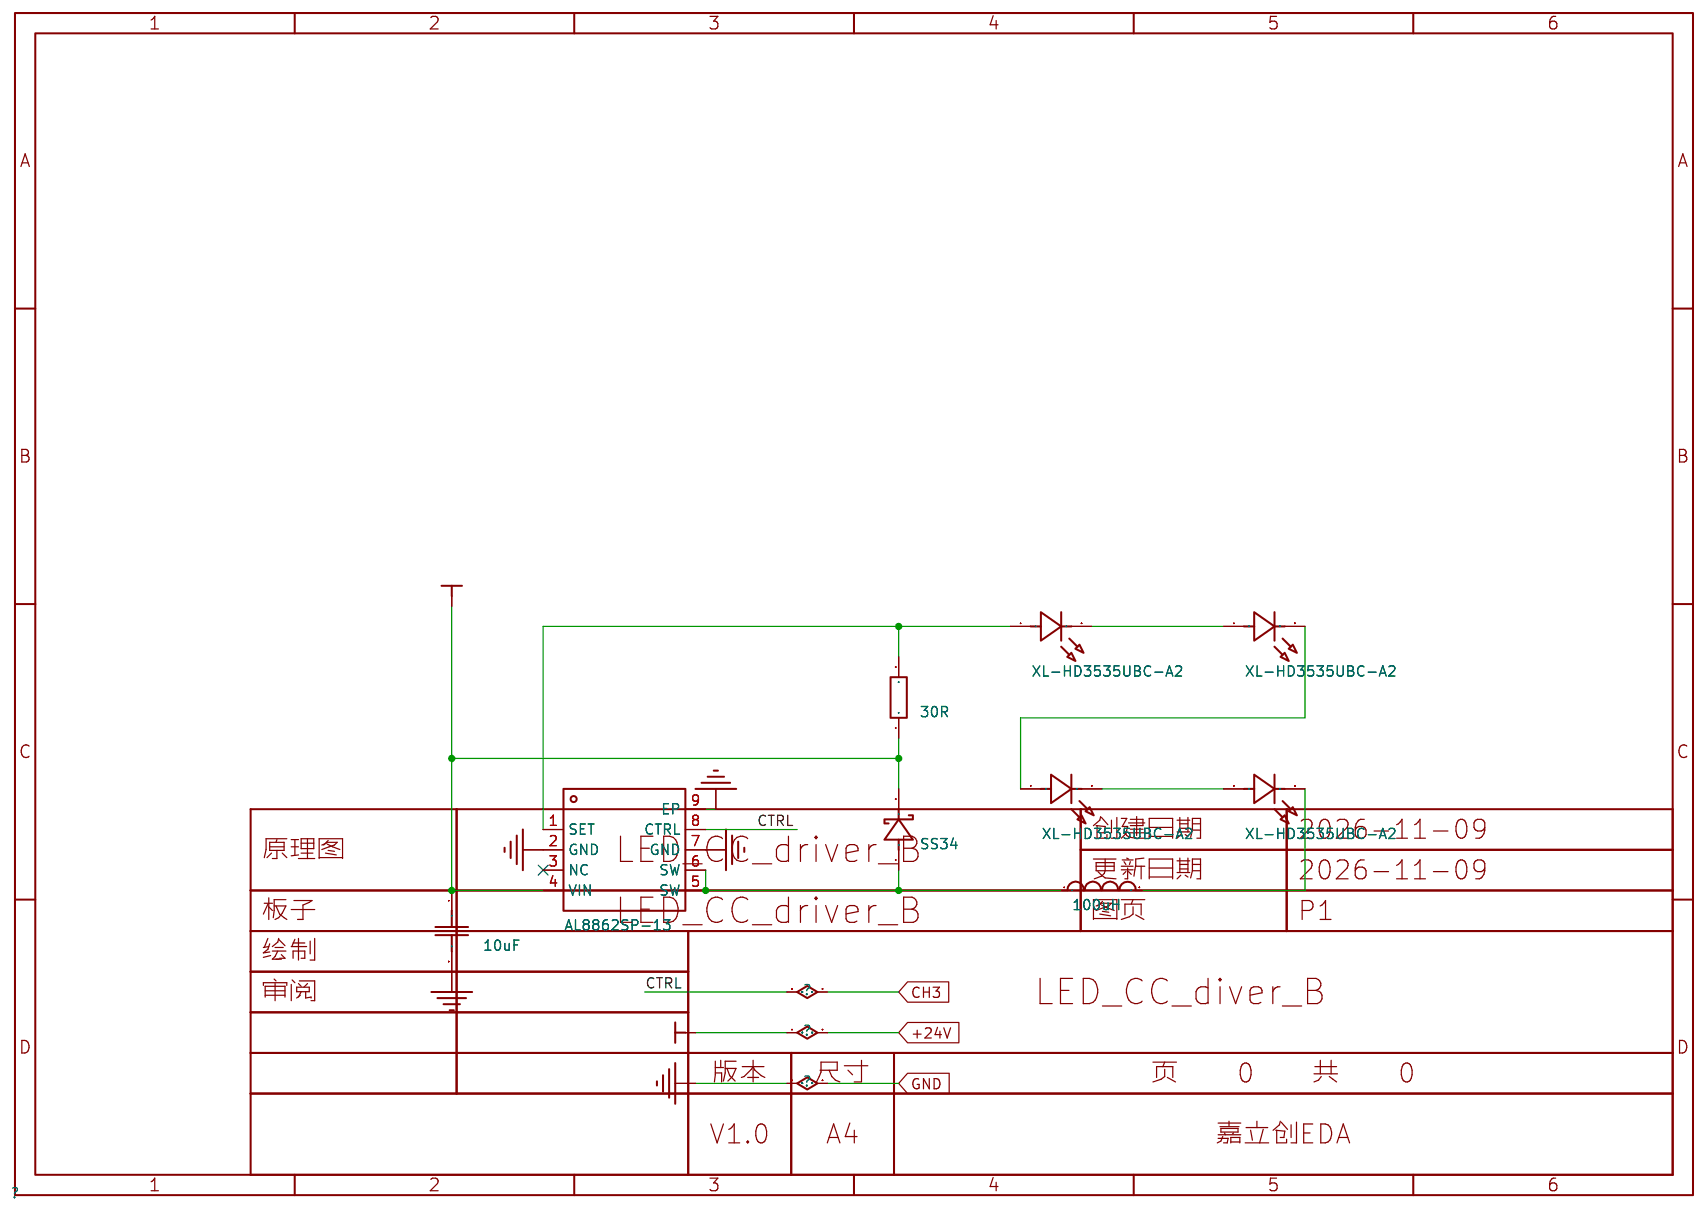
[diagram p6: schematic sheet]

## Parts
C3  10uF  [C1206]
D16  SS34  [SMA_L4.3-W2.6-LS5.0-FD]
L3  100uH  [L1210]
LED_B1  XL-HD3535UBC-A2  [LED-SMD_3P-L3.5-W3.5_XL-HD3535UBC-A2-1]
LED_B2  XL-HD3535UBC-A2  [LED-SMD_3P-L3.5-W3.5_XL-HD3535UBC-A2-1]
LED_B3  XL-HD3535UBC-A2  [LED-SMD_3P-L3.5-W3.5_XL-HD3535UBC-A2-1]
LED_B4  XL-HD3535UBC-A2  [LED-SMD_3P-L3.5-W3.5_XL-HD3535UBC-A2-1]
R3  30R  [R1206]
U6  AL8862SP-13  [SO-8_L4.9-W3.9-P1.27-LS6.0-BL-EP]

## Library data of the parts
C3 = CAP_1206: Supplier Footprint: 1206
D16 = SS34_C7420365: 二极管配置:独立式;正向压降(Vf):550mV@3A;直流反向耐压(Vr):40V;整流电流:3A;; LCSC Part Name: 电压:40V 电流:3A; Supplier Part: C7420365; Manufacturer: R+O(宏嘉诚); Supplier Footprint: SMA(DO-214AC); JLCPCB Part Class: Extended Part; Datasheet: https://item.szlcsc.com/datasheet/SS34/8397187.html; Supplier: LCSC; Diode Configuration: 独立式; Voltage - Forward(Vf@If): 550mV@3A; Voltage - DC Reverse(Vr): 40V; Current - Rectified: 3A; Reverse Leakage Current (Ir): 200uA@40V; Operating Junction Temperature Range: -55℃~+150℃; Non-Repetitive Peak Forward Surge Current: 80A
L3 = NLV32T-101J-PF: 电感值:100uH;精度:±5%;额定电流:40mA;饱和电流(Isat):-;类型:磁胶屏蔽电感;; LCSC Part Name: 100uH ±5% 停产; Supplier Part: C76836; Manufacturer: TDK; Supplier Footprint: 1210; JLCPCB Part Class: Extended Part; Datasheet: https://item.szlcsc.com/datasheet/NLV32T-101J-PF/77963.html; Supplier: LCSC; Tolerance: ±5%; Current Rating: 40mA; DC Resistance(DCR): 10Ω; Type: 磁胶屏蔽电感
LED_B1-LED_B4 = XL-HD3535UBC-A2: 灯头类型:3.5mmx3.5mm方形灯头;发光颜色:蓝色;正向压降(Vf):3.4V;功率:1W;测试电流:350mA;波长:455nm~470nm;二极管配置:独立二极管;透镜颜色:无色透明透镜;色温:-;发光强度:-;发光角度:130°;载带方式:正贴;工作温度:-40℃~+135℃;; LCSC Part Name: 3535球头蓝1W贴片式发光二极管; Supplier Part: C3646953; Manufacturer: XINGLIGHT(成兴光); Supplier Footprint: SMD3535-3P; JLCPCB Part Class: Extended Part; Datasheet: https://item.szlcsc.com/datasheet/XL-HD3535UBC-A2/4213796.html; Supplier: LCSC; Lamp Holder Type: 3.5mmx3.5mm方形灯头; Illumination Color: 蓝色; Voltage - Forward(Vf): 3.4V; Power(Watts): 1W; Test Current: 350mA; Wavelength - Dominant: 455nm~470nm; Peak Wavelength: 465nm; Diode Configuration: 独立二极管; Lens Color: 无色透明透镜; Viewing Angle: 130°; Mounting Style: 正贴; Operating Temperature: -40℃~+135℃
R3 = Res_1206: Supplier Footprint: 1206
U6 = AL8862SP-13: 类型:DC-DC;工作电压(DC):5V~60V;开关频率:1MHz;通道数:1;输出电压:-;输出电流:1A;调光:模拟；PWM;拓扑结构:降压;; LCSC Part Name: 60V、1A降压型LED驱动器; Supplier Part: C526360; Manufacturer: DIODES(美台); Supplier Footprint: SO-8-EP; JLCPCB Part Class: Extended Part; Datasheet: https://item.szlcsc.com/datasheet/AL8862SP-13/544575.html; Supplier: LCSC; Type: DC-DC; Voltage - Input(DC): 5V~60V; Frequency - Switching: 1MHz; Number of Channels: 1; Output Current: 1A; Dimming: 模拟；PWM; Features: 内置软启动；LED开路保护；过温保护(OTP)；短路保护(SCP); Topology: 降压; Operating temperature: -40℃~+105℃; Switch Tube (Built-In/External): 内置; Constant Current Accuracy: 4%

## Nets
+24V: C3.1 D16.2(K) R3.1 U6.4(VIN)
GND: C3.2 U6.2(GND) U6.7(GND) U6.9(EP)
CH3: U6.8(CTRL)
Net-(D16-1): D16.1(A) L3.1 U6.5(SW) U6.6(SW)
Net-(L3-2): L3.2 LED_B1.2(C)
Net-(LED_B1-1): LED_B1.1(A) LED_B3.2(C)
Net-(LED_B2-1): LED_B2.1(A) R3.2 U6.1(SET)
Net-(LED_B2-2): LED_B2.2(C) LED_B4.1(A)
Net-(LED_B3-1): LED_B3.1(A) LED_B4.2(C)

Not connected (* = marked no-connect by the designer): U6 3(NC)*

# Schematic 积分匀光箱板
Assembly Variant: Basic; Board Name: Board1; Create Date: 2026-11-09; Page Name: P1; Project Name: New Project_2026-11-09_17-51-48; Schematic Name: Schematic1; Update Date: 2026-11-09; Company: 嘉立创EDA; Page Size: A4; Version: V1.0
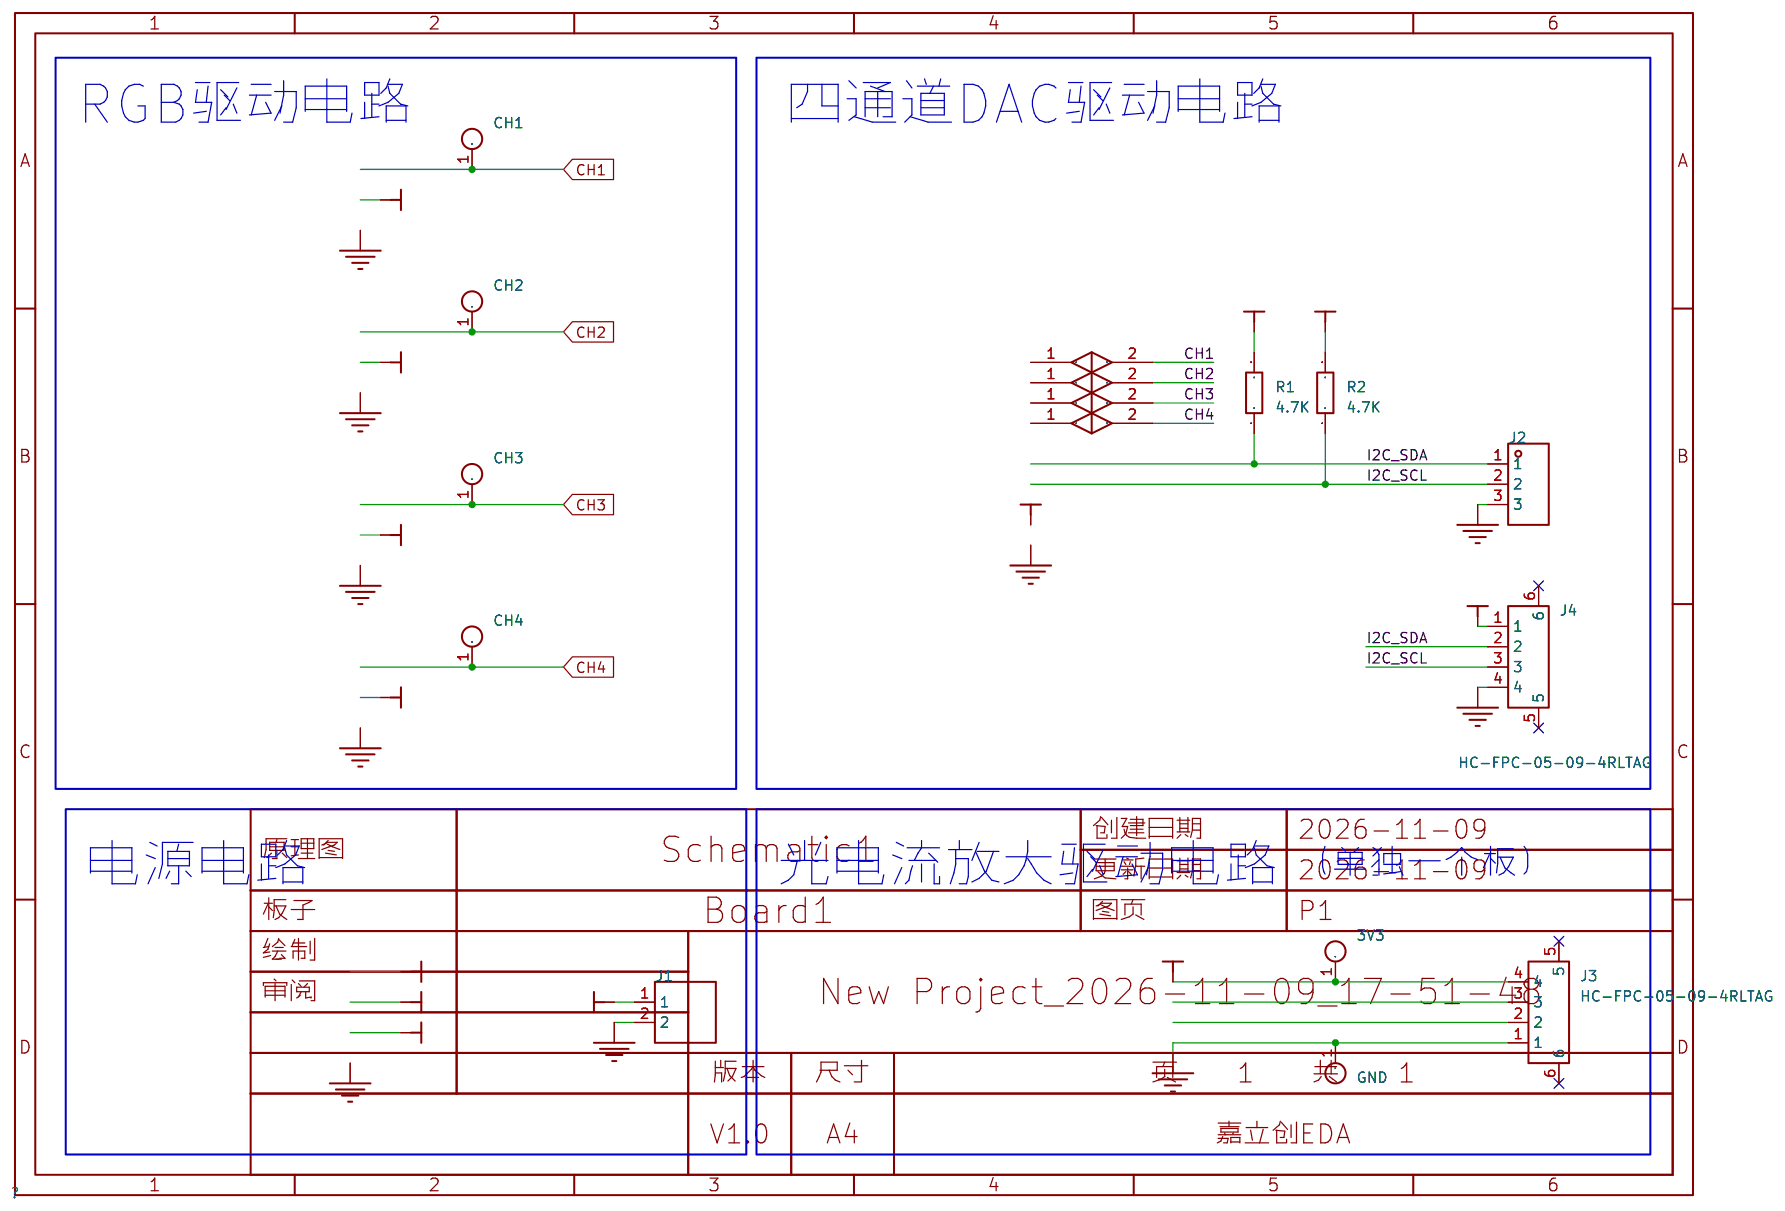
[diagram p7: schematic sheet]

## Parts
3V3  -  [test_point]
CH1  -  [test_point]
CH2  -  [test_point]
CH3  -  [test_point]
CH4  -  [test_point]
DAC  -
GND  -  [test_point]
J1  -  [HDR-TH_2P-P2.54-V-M-1]
J2  -  [HDR-TH_3P-P2.54-V-M]
J3  HC-FPC-05-09-4RLTAG  [FPC-SMD_4P-P0.50_HC-FPC-05-09-4RLTAG]
J4  HC-FPC-05-09-4RLTAG  [FPC-SMD_4P-P0.50_HC-FPC-05-09-4RLTAG]
LS  -
PWR  PWR
R1  4.7K  [R0603]
R2  4.7K  [R0603]
RGB_B  -
RGB_G  -
RGB_IR  -
RGB_R  -
U1  -  [焊盘阻焊跳线]
U2  -  [焊盘阻焊跳线]
U3  -  [焊盘阻焊跳线]
U4  -  [焊盘阻焊跳线]

## Library data of the parts
3V3 CH1-CH4 GND = 测试点
J1 = HDR-M_2.54_1x2P: Supplier Part: C124375; Supplier Footprint: 插件
J2 = HDR-M_2.54_1x3P: Supplier Part: C2937625; Supplier Footprint: 插件
J3 J4 = HC-FPC-05-09-4RLTAG: 锁定特性:翻盖式(前插后翻);触点类型:双侧触点/上下接;触点数量:4P;间距:0.5mm;安装方式:卧贴;工作温度:-55℃~+85℃;; LCSC Part Name: 翻盖式(前插后翻) 双侧触点/上下接 P数:4P 间距:0.5mm; Supplier Part: C5213746; Manufacturer: HCTL(华灿天禄); Supplier Footprint: SMD,P=0.5mm,卧贴; JLCPCB Part Class: Extended Part; Datasheet: https://item.szlcsc.com/datasheet/HC-FPC-05-09-4RLTAG/5909038.html; Supplier: LCSC; Locking Feature: 翻盖式(前插后翻); Contact Type: 双侧触点/上下接; Number of Contacts: 4P; Pitch: 0.5mm; Mounting Type: 卧贴; FFC, FCB Thickness: 0.3mm; Height Above Board: 1mm; Contact Material: 铜合金; Operating Temperature: -55℃~+85℃; Rated Voltage (Max): 50V; Current Rating (Max): 500mA; Storage Temperature: -10℃~+50℃; FPC/FFC Lock: 不带扣; Forward Foot / Back Foot: 无正反区分
R1 R2 = Res_0603: Supplier Footprint: 0603
U1-U4 = 焊盘阻焊跳线

## Nets
3V3: 3V3.1 DAC.(CH4) J3.4 J4.1 R1.2 R2.2
+24V: CH2.1 GND.1 J1.2 J2.3 J3.1 J4.4 RGB_G.(GND) U2.2
CH1: CH1.1 U1.2
CH3: CH3.1 U3.2
CH4: CH4.1 U4.2
I2C_SCL: J2.2 J4.3 R2.1
I2C_SDA: J2.1 J4.2 R1.1
VCOM: J1.1

Not connected (* = marked no-connect by the designer): J3 2 3 5* 6*; J4 5* 6*; LS (GND); PWR (3V3); RGB_B (GND); RGB_IR (GND); RGB_R (GND); U1 1; U2 1; U3 1; U4 1

## Notes on the sheet
- RGB驱动电路
- 四通道DAC驱动电路
- （单独一个板）
- 电源电路
- 光电流放大驱动电路

# Board PCB1
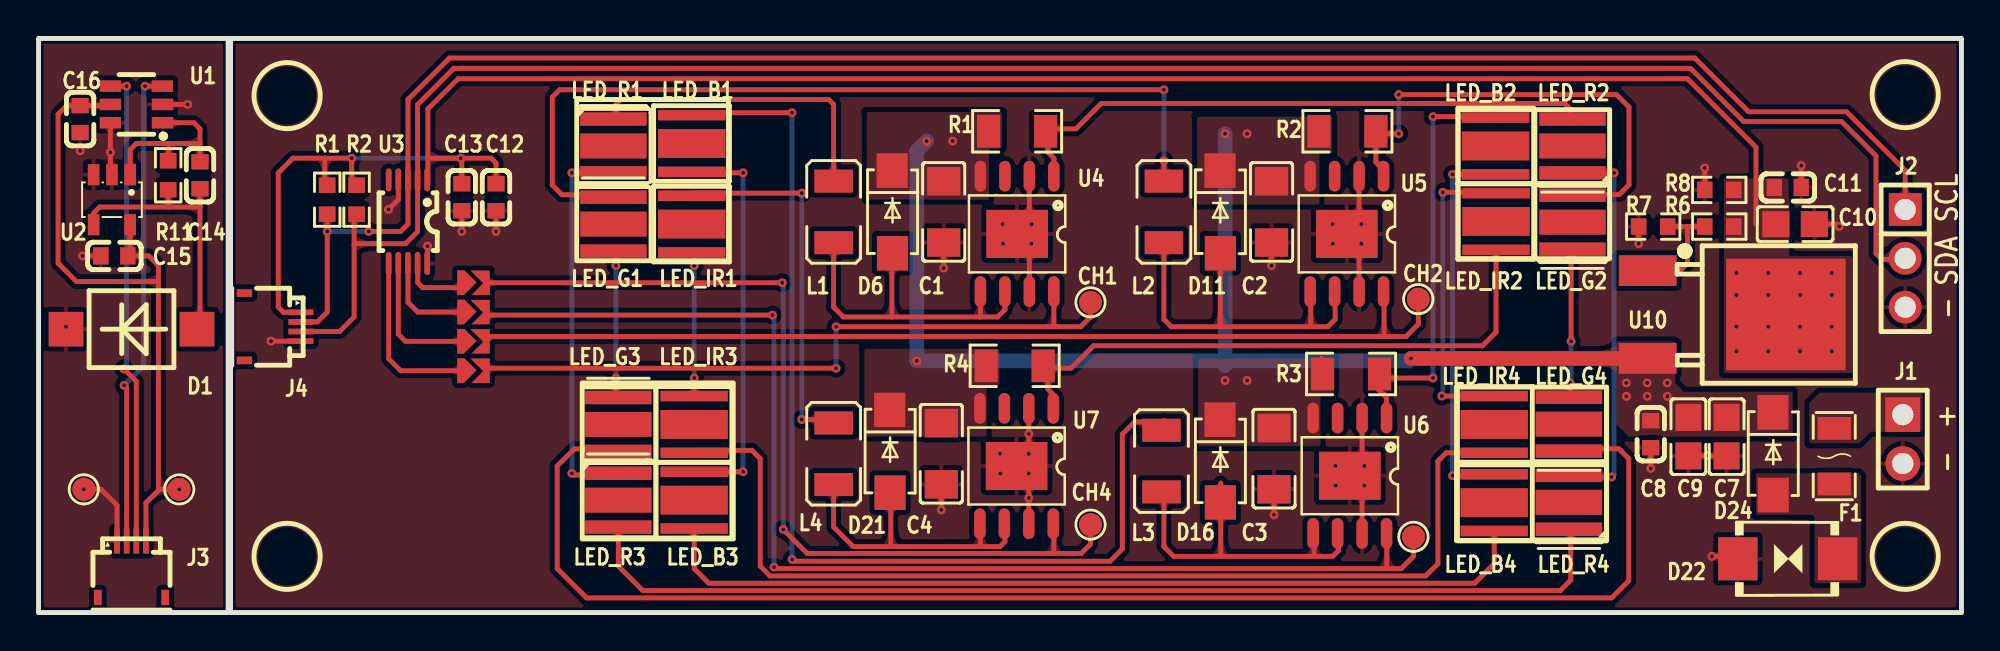
[diagram p8: board, top side]
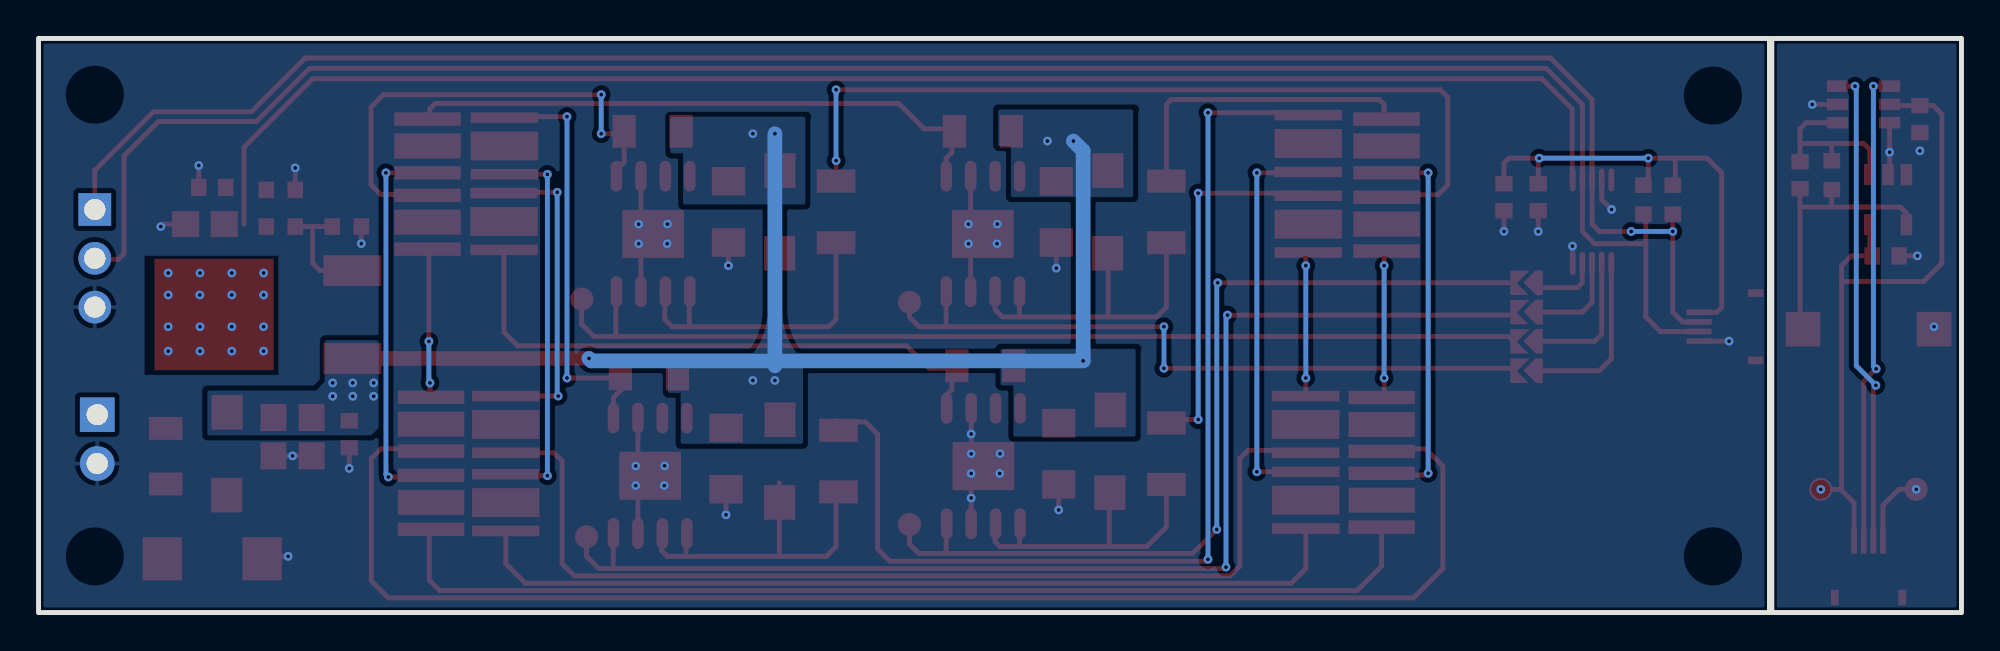
[diagram p9: board, bottom side, seen from below]

Outline 99.82 x 29.84 mm; copper layers: Top Layer, Bottom Layer. Coordinates in mm from the lower left corner of the outline.
Outline path: rectangle 0,29.84 9.84,0 ; rectangle 9.97,29.84 99.82,0
Stack: Top Layer 0.035mm / Dielectric1 1.51mm FR4 er 4.5 / Bottom Layer 0.035mm

## Design rules (mm)
spacing copperThickness1oz (default): track to track 0.102, other pairs 0.102 to 0.3
spacing copperThickness2oz: track to track 0.203, other pairs 0.152 to 0.3
track width copperThickness1oz (default): min 0.127, default 0.254, max 2.54
track width copperThickness2oz: min 0.203, default 0.254, max 2.54
differential pair differentialPair (default): width min 0.127, default 0.254, max 2.54; gap min 0.152, default 0.152
net $1I95\$1N6 uses copperRegion
net +24V uses copperRegion
net VCOM uses copperRegion
net GND uses copperRegion
pour e2879 uses PWR_default, default
pour e2884 uses PWR_default, default
pour e2886 uses PWR_default, default
pour e2888 uses PWR_default, default
pour e2890 uses PWR_default, default
pour e2927 uses PWR_copperThickness1oz
pour e2929 uses PWR_copperThickness1oz
pour e2931 uses PWR_copperThickness1oz
pour e2933 uses PWR_copperThickness1oz
pour e3011 uses PWR_copperThickness1oz

## Placement (name value [footprint] x y rotation side)
3V3  -  [test_point]  7.3 6.4 0 top
C1$RGB_R  10uF  [C1206]  46.99 20.83 270 top
C2$RGB_G  10uF  [C1206]  64.01 20.83 270 top
C3$RGB_B  10uF  [C1206]  64.13 8 270 top
C4$RGB_IR  10uF  [C1206]  46.86 8.26 270 top
C7$PWR  10uF  [C0805]  87.63 9.14 90 top
C8$PWR  100nF  [C0603]  83.69 9.27 90 top
C9$PWR  1uF  [C0805]  85.65 9.14 90 top
C10$PWR  10uF  [C0805]  91.19 20.19 180 top
C11$PWR  100nF  [C0603]  90.81 22.1 180 top
C12$DAC  100nF  [C0603]  23.75 21.59 90 top
C13$DAC  1uF  [C0603]  21.97 21.59 90 top
C14$LS  10pF  [C0603]  8.38 22.73 90 top
C15$LS  100nF  [C0603]  3.94 18.54 0 top
C16$LS  100nF  [C0603]  2.16 25.65 90 top
CH1  -  [test_point]  54.61 16.13 0 top
CH2  -  [test_point]  71.62 16.29 0 top
CH3  -  [test_point]  71.37 3.94 0 top
CH4  -  [test_point]  54.61 4.57 0 top
D1$LS  VBPW34S  [SENSOR-SMD_L4.4-W3.9]  4.83 14.73 180 top
D6$RGB_R  SS34  [SMA_L4.3-W2.6-LS5.0-FD]  44.32 20.83 90 top
D11$RGB_G  SS34  [SMA_L4.3-W2.6-LS5.0-FD]  61.34 20.83 90 top
D16$RGB_B  SS34  [SMA_L4.3-W2.6-LS5.0-FD]  61.34 7.87 90 top
D21$RGB_IR  SS34  [SMA_L4.3-W2.6-LS5.0-FD]  44.2 8.38 90 top
D22$PWR  SMBJ30CA  [SMB_L4.3-W3.6-LS5.4-BI]  90.81 2.79 180 top
D24$PWR  SS54  [SMA_L4.3-W2.6-LS5.0-FD]  90.04 8.26 90 top
F1  S1206-FC-2.0A  [F1206]  93.22 8.13 270 top
GND  -  [test_point]  2.35 6.41 0 top
J1  -  [HDR-TH_2P-P2.54-V-M-1]  96.77 9.02 270 top
J2  -  [HDR-TH_3P-P2.54-V-M]  96.9 18.42 270 top
J3  HC-FPC-05-09-4RLTAG  [FPC-SMD_4P-P0.50_HC-FPC-05-09-4RLTAG]  4.83 2.03 180 top
J4  HC-FPC-05-09-4RLTAG  [FPC-SMD_4P-P0.50_HC-FPC-05-09-4RLTAG]  11.94 14.86 90 top
L1$RGB_R  100uH  [L1210]  41.28 20.83 90 top
L2$RGB_G  100uH  [L1210]  58.42 20.83 90 top
L3$RGB_B  100uH  [L1210]  58.29 7.87 90 top
L3$RGB_IR  100uH  [L1210]  41.28 8.26 90 top
LED_B1$RGB_B  XL-HD3535UBC-A2  [LED-SMD_3P-L3.5-W3.5_XL-HD3535UBC-A2-1]  33.91 24.38 90 top
LED_B2$RGB_B  XL-HD3535UBC-A2  [LED-SMD_3P-L3.5-W3.5_XL-HD3535UBC-A2-1]  75.64 24.26 270 top
LED_B3$RGB_B  XL-HD3535UBC-A2  [LED-SMD_3P-L3.5-W3.5_XL-HD3535UBC-A2-1]  34.04 5.84 90 top
LED_B4$RGB_B  XL-HD3535UBC-A2  [LED-SMD_3P-L3.5-W3.5_XL-HD3535UBC-A2-1]  75.56 5.72 270 top
LED_G1$RGB_G  JNJ-LEHG0113W120  [LED-SMD_3P-L3.5-W3.5-R-RD_C9900043159]  29.84 20.19 270 top
LED_G2$RGB_G  JNJ-LEHG0113W120  [LED-SMD_3P-L3.5-W3.5-R-RD_C9900043159]  79.63 20.29 90 top
LED_G3$RGB_G  JNJ-LEHG0113W120  [LED-SMD_3P-L3.5-W3.5-R-RD_C9900043159]  30.1 9.78 270 top
LED_G4$RGB_G  JNJ-LEHG0113W120  [LED-SMD_3P-L3.5-W3.5-R-RD_C9900043159]  79.44 9.79 90 top
LED_IR1  XL-HD3535HIR-T4A2  [LED-SMD_3P-L3.5-W3.5_XL-HD3535UBC-A2-1]  33.91 20.19 90 top
LED_IR2  XL-HD3535HIR-T4A2  [LED-SMD_3P-L3.5-W3.5_XL-HD3535UBC-A2-1]  75.66 20.33 90 top
LED_IR3  XL-HD3535HIR-T4A2  [LED-SMD_3P-L3.5-W3.5_XL-HD3535UBC-A2-1]  34.04 9.78 90 top
LED_IR4  XL-HD3535HIR-T4A2  [LED-SMD_3P-L3.5-W3.5_XL-HD3535UBC-A2-1]  75.56 9.78 270 top
LED_R1$RGB_R  XL-HD3535SURC-A2  [LED-SMD_3P-L3.5-W3.5-R-RD-2]  29.84 24.26 270 top
LED_R2$RGB_R  XL-HD3535SURC-A2  [LED-SMD_3P-L3.5-W3.5-R-RD-2]  79.63 24.26 90 top
LED_R3$RGB_R  XL-HD3535SURC-A2  [LED-SMD_3P-L3.5-W3.5-R-RD-2]  30.1 5.84 270 top
LED_R4$RGB_R  XL-HD3535SURC-A2  [LED-SMD_3P-L3.5-W3.5-R-RD-2]  79.44 5.73 90 top
R1  4.7K  [R0603]  14.99 21.46 90 top
R1$RGB_R  30R  [R1206]  50.8 25.02 0 top
R2  4.7K  [R0603]  16.51 21.46 90 top
R2$RGB_G  30R  [R1206]  67.94 25.02 0 top
R3$RGB_B  30R  [R1206]  68.13 12.4 0 top
R4$RGB_IR  30R  [R1206]  50.67 12.83 0 top
R6$PWR  240R  [R0603]  87.25 20.07 0 top
R7$PWR  390R  [R0603]  83.82 20.07 0 top
R8$PWR  470R  [R0603]  87.25 21.97 0 top
R11$LS  47K  [R0603]  6.73 22.73 90 top
U1  -  [焊盘阻焊跳线]  22.73 12.57 0 top
U1$LS  ADS1110A0IDBVR  [SOT-23-6_L2.9-W1.6-P0.95-LS2.8-BR]  5.08 26.42 0 top
U1$PWR  LM317MDT-TR  [TO-252-2_L6.6-W6.1-P4.57-LS9.9-TL]  87.12 15.49 0 top
U2  -  [焊盘阻焊跳线]  22.73 14.1 0 top
U2$LS  OPA333AIDBVR  [SOT-23-5_L3.0-W1.7-P0.95-LS2.8-BR]  3.81 21.46 90 top
U3  -  [焊盘阻焊跳线]  22.73 15.62 0 top
U3$DAC  MCP4728T-E/UN  [MSOP-10_L3.0-W3.0-P0.50-LS4.9-BL]  19.18 20.32 180 top
U4  -  [焊盘阻焊跳线]  22.73 17.15 0 top
U4$RGB_R  AL8862SP-13  [SO-8_L4.9-W3.9-P1.27-LS6.0-BL-EP]  50.8 19.69 180 top
U5$RGB_G  AL8862SP-13  [SO-8_L4.9-W3.9-P1.27-LS6.0-BL-EP]  67.92 19.69 180 top
U6$RGB_B  AL8862SP-13  [SO-8_L4.9-W3.9-P1.27-LS6.0-BL-EP]  68.07 7.11 180 top
U7$RGB_IR  AL8862SP-13  [SO-8_L4.9-W3.9-P1.27-LS6.0-BL-EP]  50.77 7.62 180 top

## Footprints (pads in the part's own frame, mm; a bottom-side part is the same pattern mirrored in y, then rotated)
C0603
  rect 0.8x0.9 smd: 1(-0.7,0) 2(0.7,0)
C0805
  rect 1.41x1.35 smd: 1(-1,0) 2(1,0)
C1206
  rect 1.485x1.728 smd: 1(-1.593,0) 2(1.593,0)
F1206
  rect 1.19x1.728 smd: 1(-1.445,0) 2(1.445,0)
FPC-SMD_4P-P0.50_HC-FPC-05-09-4RLTAG
  rect 0.3x1.3 smd: 1(0.75,-1.68) 2(0.25,-1.68) 3(-0.25,-1.68) 4(-0.75,-1.68)
  rect 0.4x0.8 smd: 5(-1.75,1.25) 6(1.75,1.25)
HDR-TH_2P-P2.54-V-M-1
  rect 1.8x1.8 hole 1.1: 1(-1.27,0)
  round 1.8 hole 1.1: 2(1.27,0)
HDR-TH_3P-P2.54-V-M
  rect 1.7x1.7 hole 1.1: 1(-2.54,0)
  round 1.7 hole 1.1: 2(0,0) 3(2.54,0)
L1210
  rect 1.2x2 smd: 1(-1.6,0) 2(1.6,0)
LED-SMD_3P-L3.5-W3.5-R-RD-2
  rect 0.7x3.45 smd: 1(1.4,0) 2(-1.4,0)
  rect 1.3x3.45 smd: 3(0,0)
LED-SMD_3P-L3.5-W3.5-R-RD_C9900043159
  rect 0.7x3.45 smd: 1(1.4,0) 3(-1.4,0)
  rect 1.3x3.45 smd: 2(0,0)
LED-SMD_3P-L3.5-W3.5_XL-HD3535UBC-A2-1
  rect 0.55x3.5 smd: 1(-1.475,0) 2(1.475,0)
  rect 1.5x3.5 smd: 3(0,0)
MSOP-10_L3.0-W3.0-P0.50-LS4.9-BL
  oval 0.3x1.2 smd: 1(-1,-2.17) 2(-0.5,-2.17) 3(0,-2.17) 4(0.5,-2.17) 5(1,-2.17) 6(1,2.17) 7(0.5,2.17) 8(0,2.17) 9(-0.5,2.17) 10(-1,2.17)
R0603
  rect 0.806x0.864 smd: 1(-0.753,0) 2(0.753,0)
R1206
  rect 1.208x1.701 smd: 1(-1.479,0) 2(1.479,0)
SENSOR-SMD_L4.4-W3.9
  rect 1.8x1.8 smd: 1(-3.4,0) 2(3.4,0)
SMA_L4.3-W2.6-LS5.0-FD
  rect 1.8x1.62 smd: 1(-2.15,-0.009) 2(2.15,0.009)
SMB_L4.3-W3.6-LS5.4-BI
  rect 2.047x2.241 smd: 1(-2.591,0) 2(2.591,0)
SO-8_L4.9-W3.9-P1.27-LS6.0-BL-EP
  oval 0.6x1.6 smd: 1(-1.905,-3) 2(-0.635,-3) 3(0.635,-3) 4(1.905,-3) 5(1.905,3) 6(0.635,3) 7(-0.635,3) 8(-1.905,3)
  rect 3.2x2.5 smd: 9(0,0)
SOT-23-5_L3.0-W1.7-P0.95-LS2.8-BR
  rect 1.1x0.6 smd: 1(1.3,-0.95) 2(1.3,0) 3(1.3,0.95) 4(-1.3,0.95) 5(-1.3,-0.95)
SOT-23-6_L2.9-W1.6-P0.95-LS2.8-BR
  rect 1.1x0.6 smd: 1(1.35,-0.95) 2(1.35,0) 3(1.35,0.95) 4(-1.35,0.95) 5(-1.35,0) 6(-1.35,-0.95)
test_point
  round 1.2 smd: 1(0,0)
TO-252-2_L6.6-W6.1-P4.57-LS9.9-TL
  rect 3x1.6 smd: 1(-3.587,2.285) 2(-3.589,-2.285)
  rect 6.2x5.8 smd: 3(3.588,0)
焊盘阻焊跳线
  custom 1.006x1.288 smd: 1(-0.508,0)
  custom 1.003x1.27 smd: 2(0.508,0)

## Nets
3V3: 3V3.1 C10$PWR.2 C11$PWR.2 C12$DAC.2 C13$DAC.2 C15$LS.2 C16$LS.2 J3.4 J4.1 R1.2 R2.2 R6$PWR.2 R8$PWR.2 U1$LS.5 U1$PWR.3 U2$LS.5 U3$DAC.1
+24V: C1$RGB_R.1 C2$RGB_G.1 C3$RGB_B.1 C4$RGB_IR.1 C7$PWR.2 C8$PWR.2 C9$PWR.2 D6$RGB_R.2 D11$RGB_G.2 D16$RGB_B.2 D21$RGB_IR.2 D24$PWR.2 R1$RGB_R.1 R2$RGB_G.1 R3$RGB_B.1 R4$RGB_IR.1 U1$PWR.2 U4$RGB_R.4 U5$RGB_G.4 U6$RGB_B.4 U7$RGB_IR.4
GND: C1$RGB_R.2 C2$RGB_G.2 C3$RGB_B.2 C4$RGB_IR.2 C7$PWR.1 C8$PWR.1 C9$PWR.1 C10$PWR.1 C11$PWR.1 C12$DAC.1 C13$DAC.1 C15$LS.1 C16$LS.1 D1$LS.2 D22$PWR.2 GND.1 J1.2 J2.3 J3.1 J4.4 R7$PWR.1 R8$PWR.1 U1$LS.2 U1$LS.6 U2$LS.2 U2$LS.3 U3$DAC.4 U3$DAC.10 U4$RGB_R.2 U4$RGB_R.7 U4$RGB_R.9 U5$RGB_G.2 U5$RGB_G.7 U5$RGB_G.9 U6$RGB_B.2 U6$RGB_B.7 U6$RGB_B.9 U7$RGB_IR.2 U7$RGB_IR.7 U7$RGB_IR.9
$1I27\$1N8: L3$RGB_B.2 LED_B1$RGB_B.2
$1I27\$1N9: LED_B1$RGB_B.1 LED_B3$RGB_B.2
$1I27\$1N10: LED_B3$RGB_B.1 LED_B4$RGB_B.2
$1I27\$1N11: LED_B2$RGB_B.2 LED_B4$RGB_B.1
$1I27\$1N14: D16$RGB_B.1 L3$RGB_B.1 U6$RGB_B.5 U6$RGB_B.6
$1I27\$1N18: LED_B2$RGB_B.1 R3$RGB_B.2 U6$RGB_B.1
$1I28\$1N8: L3$RGB_IR.2 LED_IR1.2
$1I28\$1N9: LED_IR1.1 LED_IR3.2
$1I28\$1N10: LED_IR3.1 LED_IR4.2
$1I28\$1N11: LED_IR2.2 LED_IR4.1
$1I28\$1N14: D21$RGB_IR.1 L3$RGB_IR.1 U7$RGB_IR.5 U7$RGB_IR.6
$1I28\$1N18: LED_IR2.1 R4$RGB_IR.2 U7$RGB_IR.1
$1I29\$1N5: D6$RGB_R.1 L1$RGB_R.1 U4$RGB_R.5 U4$RGB_R.6
$1I29\$1N8: LED_R2$RGB_R.2 LED_R4$RGB_R.1
$1I29\$1N9: LED_R3$RGB_R.1 LED_R4$RGB_R.2
$1I29\$1N10: LED_R1$RGB_R.1 LED_R3$RGB_R.2
$1I29\$1N11: L1$RGB_R.2 LED_R1$RGB_R.2
$1I29\$1N15: LED_R2$RGB_R.1 R1$RGB_R.2 U4$RGB_R.1
$1I78\$1N10: C14$LS.2 R11$LS.2 U1$LS.1 U2$LS.1
$1I78\$1N14: C14$LS.1 D1$LS.1 R11$LS.1 U2$LS.4
$1I78\I2C_SCL: J3.2 U1$LS.3
$1I78\I2C_SDA: J3.3 U1$LS.4
$1I79\CH1: U1.1 U3$DAC.6
$1I79\CH2: U2.1 U3$DAC.7
$1I79\CH3: U3.1 U3$DAC.8
$1I79\CH4: U3$DAC.9 U4.1
$1I95\$1N1: R6$PWR.1 R7$PWR.2 U1$PWR.1
$1I95\$1N6: D22$PWR.1 D24$PWR.1 F1.2
$1I114\$1N8: L2$RGB_G.2 LED_G1$RGB_G.3
$1I114\$1N9: LED_G1$RGB_G.1 LED_G3$RGB_G.3
$1I114\$1N10: LED_G3$RGB_G.1 LED_G4$RGB_G.3
$1I114\$1N11: LED_G2$RGB_G.3 LED_G4$RGB_G.1
$1I114\$1N14: D11$RGB_G.1 L2$RGB_G.1 U5$RGB_G.5 U5$RGB_G.6
$1I114\$1N18: LED_G2$RGB_G.1 R2$RGB_G.2 U5$RGB_G.1
CH1: CH1.1 U1.2 U4$RGB_R.8
CH2: CH2.1 U2.2 U5$RGB_G.8
CH3: CH3.1 U3.2 U6$RGB_B.8
CH4: CH4.1 U4.2 U7$RGB_IR.8
I2C_SCL: J2.2 J4.3 R2.1 U3$DAC.2
I2C_SDA: J2.1 J4.2 R1.1 U3$DAC.3
VCOM: F1.1 J1.1

Pads without a net: J3 5 6; J4 5 6; LED_B1$RGB_B 3; LED_B2$RGB_B 3; LED_B3$RGB_B 3; LED_B4$RGB_B 3; LED_G1$RGB_G 2; LED_G2$RGB_G 2; LED_G3$RGB_G 2; LED_G4$RGB_G 2; LED_IR1 3; LED_IR2 3; LED_IR3 3; LED_IR4 3; LED_R1$RGB_R 3; LED_R2$RGB_R 3; LED_R3$RGB_R 3; LED_R4$RGB_R 3; U3$DAC 5; U4$RGB_R 3; U5$RGB_G 3; U6$RGB_B 3; U7$RGB_IR 3

## Via types
v1: diameter 0.457, hole 0.203, Top Layer to Bottom Layer, 111 vias

## Routing (per net, layer and track width the routed paths; a pad name or vN(x,y) marks a point on that pad's centre or on a via; arc(x,y) is an arc through that point)
3V3: length 141.7
  Top Layer w0.254: 5.58,3.28 5.58,5.7 6.28,6.4 ; 89.15,20.19 89.15,24.19 85.59,27.75 21.78,27.75 20.21,26.18 20.21,23.62 ; v1(21.92,23.62) 23.49,23.62 23.75,23.37 23.75,22.16 ; v1(21.92,23.62) 20.21,23.62 ; v1(21.92,23.62) 21.97,23.57 21.97,22.16 ; 14.86,23.62 14.86,22.34 14.73,22.22 ; 14.86,23.62 v1(16.26,23.62) 16.26,22.22 ; 14.86,23.62 13.21,23.62 12.45,22.86 12.45,15.88 12.71,15.61 13.19,15.61 ; 20.21,23.62 20.21,22.27 20.18,22.24 ; 6.28,6.4 v1(7.3,6.4) ; 6.28,6.4 6.22,6.4 6.22,17.21 ; 6.22,17.21 1.97,17.21 1.02,18.16 1.02,25.91 1.46,26.35 C16$LS.2 3.67,26.35 U1$LS.5 ; 6.22,17.21 6.22,18.03 5.71,18.54 4.76,18.54 ; 4.76,18.54 U2$LS.5 ; 4.76,18.54 C15$LS.2
  Bottom Layer w0.254: v1(16.26,23.62) v1(21.92,23.62)
  vias: v1(88.14,17.65) v1(88.14,16.51) v1(88.14,14.86) v1(88.14,13.59) v1(89.79,17.65) v1(89.79,16.51) v1(89.79,14.86) v1(89.79,13.59) v1(91.44,17.65) v1(91.45,16.51) v1(91.44,14.86) v1(91.44,13.59) v1(93.09,17.65) v1(93.09,16.51) v1(93.09,14.86) v1(93.09,13.59)
+24V: length 62.6
  Top Layer w0.254: 66.59,12.19 66.59,13.21
  Top Layer w0.762: 83.41,13.21 v1(71.25,13.21)
  Bottom Layer w0.762: 61.59,13.08 v1(45.59,13.08) 45.59,24 v1(46.1,24.51) ; 61.59,13.08 61.59,12.83 ; 61.59,13.08 v1(61.59,24.89) ; 61.59,13.08 71.12,13.08 v1(71.25,13.21)
  vias: v1(47.45,24.51) v1(61.59,12.07) v1(62.74,24.89) v1(62.74,12.07) v1(82.42,11.94) v1(82.43,11.24) v1(83.51,11.94) v1(83.51,11.24) v1(84.55,11.94) v1(84.55,11.24)
GND: length 55.6
  Top Layer w0.254: U7$RGB_IR.2 v1(51.41,9.28) v1(51.41,8.25) U7$RGB_IR.9 51.41,6.98 v1(51.41,5.96) U7$RGB_IR.7 ; U3$DAC.10 20.19,18.17 v1(20.19,19.05) ; C12$DAC.1 v1(23.75,19.81) ; 13.19,14.11 v1(12.06,14.11) ; v1(86.87,2.92) 88.09,2.92 D22$PWR.2 ; v1(18.16,20.96) 18.68,21.47 U3$DAC.4 ; C10$PWR.1 93.34,20.19 v1(93.47,20.07) ; R8$PWR.1 v1(86.5,23.11) ; v1(2.35,6.41) 3.25,6.41 4.08,5.58 4.08,3.28 ; U2$LS.2 3.73,22.84 v1(3.73,23.93) U1$LS.6 ; C9$PWR.1 v1(86.63,8.14) C7$PWR.1 ; C15$LS.1 v1(2.29,18.54) ; U5$RGB_G.2 68.55,20.32 U5$RGB_G.9 68.55,19.05 U5$RGB_G.7 ; C2$RGB_G.2 v1(64.01,18.03) ; U6$RGB_B.2 68.71,7.75 U6$RGB_B.9 68.71,6.48 U6$RGB_B.7 ; C1$RGB_R.2 v1(46.99,17.91) ; C13$DAC.1 v1(21.97,19.81) ; C11$PWR.1 v1(91.5,23.24) ; U1$LS.2 v1(7.75,26.42) ; C4$RGB_IR.2 v1(46.86,5.33) ; 83.69,8.57 v1(83.69,7.49) ; C3$RGB_B.2 v1(64.13,5.08) ; 51.44,16.69 51.44,19.05 U4$RGB_R.9 51.44,20.32 51.44,22.69 ; R7$PWR.1 v1(83.07,19.18)
  vias: v1(1.43,14.86) v1(2.16,24) v1(49.91,8.26) v1(49.93,7.23) v1(50.05,20.2) v1(50.07,19.17) v1(51.41,7.23) v1(51.55,20.19) v1(51.55,19.17) v1(67.17,20.2) v1(67.19,19.17) v1(67.32,7.62) v1(67.34,6.6) v1(68.67,20.19) v1(68.67,19.17) v1(68.82,7.62) v1(68.82,6.6)
$1I27\$1N8: length 54.2
  Top Layer w0.254: v1(39.12,25.99) 34.04,25.99 ; 58.42,9.98 58.34,9.91 56.9,9.91 56.26,9.27 56.26,3.3 55.63,2.67 39.21,2.67 v1(39.12,2.76)
  Bottom Layer w0.254: v1(39.12,2.76) v1(39.12,25.99)
$1I27\$1N9: length 20.7
  Top Layer w0.254: LED_B3$RGB_B.2 v1(36.58,7.32) ; v1(36.58,22.86) 34.21,22.86 34.04,23.04
  Bottom Layer w0.254: v1(36.58,7.32) v1(36.58,22.86)
$1I27\$1N10: length 45.9
  Top Layer w0.254: 75.56,4.11 75.56,2.54 74.55,1.52 34.8,1.52 34.04,2.29 LED_B3$RGB_B.1
$1I27\$1N11: length 20.2
  Top Layer w0.254: 75.69,22.66 75.56,22.78 v1(73.41,22.78) ; v1(73.41,7.11) 75.52,7.11 75.56,7.06
  Bottom Layer w0.254: v1(73.41,22.78) v1(73.41,7.11)
$1I27\$1N14: length 18.6
  Top Layer w0.254: 61.37,2.92 61.37,6.73 ; 61.37,2.92 66.21,2.92 ; 61.37,2.92 58.93,2.92 58.42,3.43 58.42,6.27 ; 67.48,4.34 67.48,3.22 67.18,2.92 66.21,2.92 ; 66.21,2.92 66.21,4.34
$1I27\$1N18: length 22.4
  Top Layer w0.254: v1(72.39,25.78) 75.52,25.78 75.69,25.61 ; 70.02,10.34 69.98,10.39 69.98,11.18 69.55,11.6 69.55,12.57 69.93,12.19 v1(72.39,12.19)
  Bottom Layer w0.254: v1(72.39,12.19) v1(72.39,25.78)
$1I28\$1N8: length 19
  Top Layer w0.254: v1(39.62,21.8) 34.04,21.8 34.04,21.8 ; 41.28,9.98 41.22,10.03 v1(39.62,10.03)
  Bottom Layer w0.254: v1(39.62,21.8) v1(39.62,10.03)
$1I28\$1N9: length 7.5
  Top Layer w0.254: v1(34.04,18.03) 34.04,18.84 ; 34.04,11.38 v1(34.04,12.19)
  Bottom Layer w0.254: v1(34.04,12.19) v1(34.04,18.03)
$1I28\$1N10: length 53.3
  Top Layer w0.254: LED_IR4.2 73.07,8.3 72.64,7.87 72.64,2.54 72.01,1.91 37.97,1.91 37.47,2.41 37.47,8 37.03,8.43 34.04,8.43
$1I28\$1N11: length 16.1
  Top Layer w0.254: LED_IR4.1 v1(72.85,11.25) ; v1(72.9,21.85) 75.51,21.85 75.63,21.72
  Bottom Layer w0.254: v1(72.9,21.85) 72.9,11.3 v1(72.85,11.25)
$1I28\$1N14: length 16.3
  Top Layer w0.254: 48.91,3.43 48.89,3.44 48.89,4.62 ; 48.91,3.43 49.91,3.43 50.16,3.68 50.16,4.62 ; 48.91,3.43 44.24,3.43 ; 44.24,3.43 44.24,5.81 44.21,5.85 ; 44.24,3.43 42.29,3.43 41.28,4.45 41.28,6.78
$1I28\$1N18: length 30.8
  Top Layer w0.254: 52.41,12.7 53.59,12.7 54.76,13.87 74.95,13.87 75.66,14.57 LED_IR2.1 ; 52.41,12.7 52.41,11.6 52.7,11.3 52.7,10.52 52.75,10.47 ; 52.41,12.7 52.28,12.7
$1I29\$1N5: length 17.9
  Top Layer w0.254: 44.21,18.68 44.3,18.58 44.3,15.37 ; 48.86,15.37 49.78,15.37 50.17,15.75 50.17,16.54 ; 48.86,15.37 44.3,15.37 ; 48.86,15.37 48.9,15.4 48.9,16.54 ; 44.3,15.37 41.78,15.37 41.28,15.88 L1$RGB_R.1
$1I29\$1N8: length 20.3
  Top Layer w0.254: 79.54,7.05 v1(81.66,7.05) ; v1(81.79,22.86) 79.59,22.86 79.52,22.79
  Bottom Layer w0.254: v1(81.79,22.86) 81.79,7.17 v1(81.66,7.05)
$1I29\$1N9: length 54.7
  Top Layer w0.254: 79.54,4.25 79.54,1.69 78.99,1.14 31.37,1.14 30.1,2.41 30.1,4.33 30.12,4.35
$1I29\$1N10: length 20.4
  Top Layer w0.254: v1(27.69,7.24) 27.78,7.15 30.12,7.15 ; v1(27.69,22.86) 29.72,22.86 29.85,22.98 29.97,22.98
  Bottom Layer w0.254: v1(27.69,22.86) v1(27.69,7.24)
$1I29\$1N11: length 16.1
  Top Layer w0.254: 29.97,25.78 29.97,26.42 30.23,26.67 41.02,26.67 41.28,26.42 L1$RGB_R.2
$1I29\$1N15: length 31.1
  Top Layer w0.254: 79.52,25.59 79.52,26.16 79.22,26.47 55.17,26.47 53.85,25.15 52.41,25.15 52.41,23.92 52.71,23.62 52.71,22.54
$1I78\$1N10: length 10
  Top Layer w0.254: 8.38,23.36 8.38,24.38 ; 8.38,24.38 6.74,24.38 ; 8.38,24.38 8.38,25.15 8.06,25.47 U1$LS.1 ; U2$LS.1 4.76,24.06 5.08,24.38 6.74,24.38 ; 6.74,24.38 6.74,23.32 6.73,23.31
$1I78\$1N14: length 14.1
  Top Layer w0.254: 6.72,21.08 6.73,21.09 6.73,21.91 ; 6.72,21.08 8.38,21.08 ; 6.72,21.08 3.17,21.08 2.86,20.77 U2$LS.4 ; 8.38,21.08 8.38,15.02 8.23,14.86 ; 8.38,21.08 8.38,21.85
$1I78\I2C_SCL: length 25.5
  Top Layer w0.254: U1$LS.3 v1(5.53,27.37) ; v1(4.44,11.81) 4.58,11.68 4.58,3.28
  Bottom Layer w0.254: v1(4.44,11.81) 5.46,12.83 5.46,27.3 v1(5.53,27.37)
$1I78\I2C_SDA: length 25.3
  Top Layer w0.254: 5.08,3.28 5.08,12.02 v1(4.43,12.67) ; U1$LS.4 v1(4.57,27.37)
  Bottom Layer w0.254: v1(4.43,12.67) 4.57,12.81 v1(4.57,27.37)
$1I79\CH1: length 8.9
  Top Layer w0.254: 22.14,12.57 18.8,12.57 18.18,13.19 18.18,17.9
$1I79\CH2: length 7
  Top Layer w0.254: 22.14,14.1 19.05,14.1 18.68,14.47 18.68,17.9
$1I79\CH3: length 4.9
  Top Layer w0.254: 19.18,17.9 19.18,16.13 19.68,15.62 22.14,15.62
$1I79\CH4: length 3.4
  Top Layer w0.254: 22.14,17.15 21.89,16.89 19.94,16.89 19.68,17.15 19.68,17.89 19.68,17.9
$1I95\$1N1: length 5.8
  Top Layer w0.254: 85.6,20.07 85.6,18.16 85.22,17.78 83.41,17.78 ; 85.6,20.07 86.11,20.07 ; 85.6,20.07 R7$PWR.2
$1I114\$1N8: length 44.7
  Top Layer w0.254: v1(58.42,27.18) 27.05,27.18 26.67,26.8 26.67,22.23 27.17,21.72 29.97,21.72 ; L2$RGB_G.2 v1(58.42,23.5)
  Bottom Layer w0.254: v1(58.42,23.5) v1(58.42,27.18)
$1I114\$1N9: length 7.7
  Top Layer w0.254: 30.1,11.31 29.97,11.43 v1(29.97,12.19) ; 29.97,18.92 v1(29.97,18.03)
  Bottom Layer w0.254: v1(29.97,18.03) v1(29.97,12.19)
$1I114\$1N10: length 75.2
  Top Layer w0.254: 79.5,8.38 79.64,8.52 82.04,8.52 82.55,8 82.55,1.65 81.66,0.76 28.45,0.76 26.92,2.29 26.92,7.62 27.81,8.51 30.1,8.51 30.1,8.51
$1I114\$1N11: length 7.7
  Top Layer w0.254: v1(79.5,11.94) 79.5,11.37 79.45,11.32 ; 79.56,18.93 v1(79.56,14.1)
  Bottom Layer w0.254: v1(79.56,14.1) 79.56,11.99 v1(79.5,11.94)
$1I114\$1N14: length 18.3
  Top Layer w0.254: 65.97,14.86 66.93,14.86 67.31,15.24 67.31,16.18 ; 65.97,14.86 66.04,14.93 66.04,16.18 ; 65.97,14.86 61.33,14.86 ; 61.33,14.86 58.8,14.86 58.42,15.24 58.42,18.72 ; 61.33,14.86 61.35,14.88 61.35,18.17
$1I114\$1N18: length 25.3
  Top Layer w0.254: v1(70.61,26.92) 81.91,26.92 82.56,26.28 82.56,22.24 82.05,21.73 79.56,21.73 ; 69.42,24.89 v1(70.61,24.89) ; 69.85,22.18 69.85,22.99 69.42,23.41 69.42,24.64
  Bottom Layer w0.254: v1(70.61,26.92) v1(70.61,24.89)
CH1: length 36.3
  Top Layer w0.254: v1(41.4,12.7) 23.37,12.7 U1.2 ; 54.61,16.15 54.61,15.37 54.1,14.86 52.82,14.86 ; 52.82,14.86 v1(41.4,14.86) ; 52.82,14.86 52.71,14.97 52.71,16.54
  Bottom Layer w0.254: v1(41.4,12.7) v1(41.4,14.86)
CH2: length 51.9
  Top Layer w0.254: 71.24,16.17 71.63,15.78 71.63,14.99 70.99,14.35 69.85,14.35 ; 69.85,14.35 69.85,14.35 69.85,16.18 ; 69.85,14.35 23.49,14.35 U2.2
CH3: length 64.2
  Top Layer w0.254: v1(38.18,2.36) 38.26,2.29 69.99,2.29 ; 69.99,2.29 70.74,2.29 71.37,2.92 CH3.1 ; 69.99,2.29 69.99,3.97 69.98,3.98 ; 23.27,15.46 v1(38.1,15.46)
  Bottom Layer w0.254: v1(38.18,2.36) 38.18,15.38 v1(38.1,15.46)
CH4: length 47.5
  Top Layer w0.254: CH4.1 54.61,3.56 54.13,3.07 52.67,3.07 ; 52.67,3.07 52.7,3.11 52.7,4.62 ; 52.67,3.07 39.9,3.07 v1(38.66,4.32) ; U4.2 v1(38.61,17.15)
  Bottom Layer w0.254: v1(38.61,17.15) 38.66,17.09 v1(38.66,4.32)
I2C_SCL: length 104.2
  Top Layer w0.254: 16.38,19.09 16.38,20.58 16.26,20.71 ; 16.38,19.09 16.38,15.37 15.62,14.61 13.19,14.61 ; 16.38,19.09 16.46,19.18 19.05,19.18 19.68,19.8 19.68,26.41 21.56,28.29 85.76,28.29 88.52,25.53 93.6,25.53 95.38,23.74 95.38,18.66 95.68,18.36 96.85,18.36 J2.2
I2C_SDA: length 101.1
  Top Layer w0.254: J2.1 96.9,22.99 93.85,26.04 88.77,26.04 85.98,28.83 21.34,28.83 19.18,26.67 19.18,20.19 18.8,19.81 v1(17.14,19.81) ; 14.73,20.71 14.99,20.46 v1(14.99,19.81) 14.99,15.62 14.47,15.11 13.19,15.11
  Bottom Layer w0.254: v1(17.14,19.81) v1(14.99,19.81)

## Copper pours and planes (outline as drawn; the poured copper is in the pictures)
3V3 on Top Layer: 87.49,22.57 90.78,22.57 90.89,22.68 90.89,18.54 94.11,18.54 94.19,18.46 94.19,12.45 87.49,12.45
+24V on Top Layer: 81.91,14.1 84.92,14.1 84.96,14.05 84.96,11.94 85.42,11.48 91.06,11.48 91.06,9.14 82.55,9.14 81.91,9.78
+24V on Top Layer: 67.21,13.21 67.21,11.33 67.18,11.3 66.55,11.3 66.55,8.65 60.2,8.65 60.2,13.17 60.16,13.21
+24V on Top Layer: 49.88,13.71 49.88,11.83 49.85,11.8 49.22,11.8 49.22,9.15 42.87,9.15 42.87,13.67 42.83,13.71
+24V on Top Layer: 50.01,26.03 50.01,24.15 49.98,24.12 49.34,24.12 49.34,21.47 43,21.47 43,25.99 42.95,26.03
+24V on Top Layer: 67.15,25.78 67.15,23.9 67.12,23.87 66.49,23.87 66.49,21.22 60.14,21.22 60.14,25.73 60.1,25.78
+24V on Bottom Layer: 49.88,13.71 49.88,11.83 49.85,11.8 49.22,11.8 49.22,9.15 42.87,9.15 42.87,13.67 42.83,13.71
+24V on Bottom Layer: 67.03,25.78 67.03,23.9 67,23.87 66.36,23.87 66.36,21.22 60.01,21.22 60.01,25.73 59.97,25.78
+24V on Bottom Layer: 50.01,26.16 50.01,24.28 49.98,24.25 49.34,24.25 49.34,21.6 43,21.6 43,26.12 42.95,26.16
+24V on Bottom Layer: 81.91,14.16 84.92,14.16 84.96,14.12 84.96,12 85.42,11.54 91.06,11.54 91.06,9.21 82.55,9.21 81.91,9.84
+24V on Bottom Layer: 67.15,13.33 67.15,11.45 67.12,11.42 66.49,11.42 66.49,8.77 60.14,8.77 60.14,13.29 60.1,13.33
GND on Top Layer: 0,29.8 9.8,29.8 9.8,0 0,0
GND on Top Layer: 9.97,29.8 99.82,29.8 99.82,0 9.97,0
GND on Bottom Layer: 9.97,29.84 99.82,29.84 99.82,0 9.97,0
GND on Bottom Layer: 0,29.8 9.8,29.8 9.8,0 0,0
$1I95\$1N6 on Top Layer: 89.15,7.24 94.49,7.24 94.62,7.11 94.62,1.52 92.2,1.52 92.2,4.95 92.07,5.08 89.15,5.08
VCOM on Top Layer: 97.79,9.4 95.11,9.4 94.52,8.8 91.92,8.8 91.92,10.9 92.46,11.43 97.79,11.43

Small or netless copper shapes (teardrops, artwork), in the pictures only: 261 on Top Layer, 41 on Bottom Layer

## Text on the board
Document Layer: VCUT | ↑
Top Silkscreen Layer: U2 | C16 | C15 | R11 | J3 | C14 | D1 | U1 | J4 | R1 | R2 | U3 | C13 | C12 | LED_G3 | LED_R1 | LED_G1 | LED_R3 | LED_IR1 | LED_IR3 | LED_B1 | LED_B3 | L4 | L1 | D21 | D6 | C4 | C1 | R4 | CH4 | U7 | U4 | CH1 | L2 | L3 | D16 | D11 | C2 | C3 | R3 | U5 | CH2 | U6 | LED_IR4 | LED_B2 | LED_IR2 | LED_B4 | LED_G2 | LED_G4 | LED_R2 | LED_R4 | R7 | U10 | C8 | R8 | R6 | D22 | C9 | C7 | D24 | C11 | C10 | F1 | J2 | J1 | + | - | SCL | SDA
